# Altium project ELF 2 & ELF 2_Lite V1.3.PrjPcb (part 1 of 3)
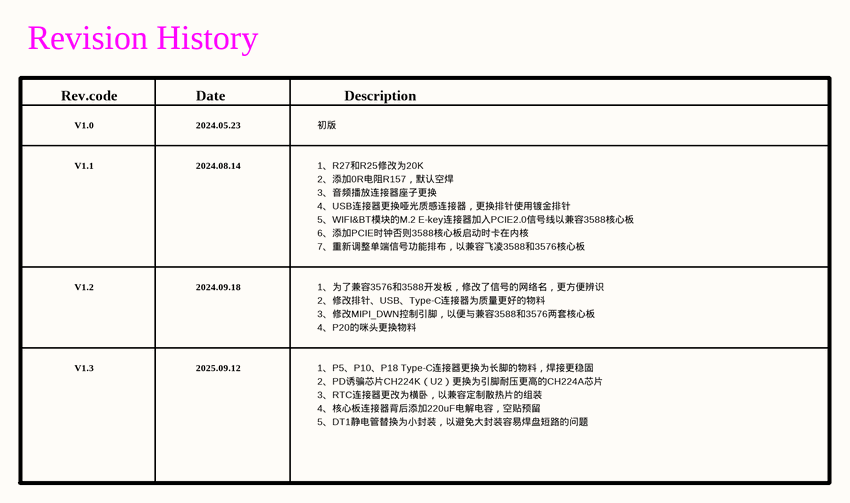
[diagram p0: 01 Revision History.SchDoc]
11 sheets, 469 parts. Net scope: global (net labels, ports and power ports of the same name join across sheets).
Board file: ELF 2 & ELF 2_Lite V1.3.PcbDoc
Sheets:
  01 Revision History.SchDoc
  02 Connector.SchDoc
  03 PWR.SchDoc
  04 Debug&TF card&RTC.SchDoc
  05 Ethernet.SchDoc
  06 MIPI.SchDoc
  07 HDMI.SchDoc
  08 TypeC USB DP.SchDoc
  09 Audio.SchDoc
  10 USB2.0 HUB&PCIe.SchDoc
  11 WIFI&BT&GPIO.SchDoc

## Sheet 01 Revision History.SchDoc
size A4; Revision: V1.2; SheetNumber: 1; SheetTotal: 11

### Notes on the sheet
- Revision History
- Rev.code
- Date
- Description
- V1.0
- V1.1
- 2024.05.23
- 2024.08.14
- 初版
- 1、R27和R25修改为20K
- 2、添加0R电阻R157，默认空焊
- 4、USB连接器更换哑光质感连接器，更换排针使用镀金排针
- 3、音频播放连接器座子更换
- 5、WIFI&BT模块的M.2 E-key连接器加入PCIE2.0信号线以兼容3588核心板
- 6、添加PCIE时钟否则3588核心板启动时卡在内核
- V1.2
- 2024.09.18
- 7、重新调整单端信号功能排布，以兼容飞凌3588和3576核心板
- 1、为了兼容3576和3588开发板，修改了信号的网络名，更方便辨识
- 2、修改排针、USB、Type-C连接器为质量更好的物料
- V1.3
- 2025.09.12
- 3、修改MIPI_DWN控制引脚，以便与兼容3588和3576两套核心板
- 4、P20的咪头更换物料
- 1、P5、P10、P18 Type-C连接器更换为长脚的物料，焊接更稳固
- 2、PD诱骗芯片CH224K（U2）更换为引脚耐压更高的CH224A芯片
- 5、DT1静电管替换为小封装，以避免大封装容易焊盘短路的问题
- 4、核心板连接器背后添加220uF电解电容，空贴预留
- 3、RTC连接器更改为横卧，以兼容定制散热片的组装
- 设计
- 审核
- 工艺
- 图纸名称
- 夏鑫宇
- 批准
- 标准化
- 日期
- 版本
- 页码
- 第
- 页
- 共

## Sheet 02 Connector.SchDoc
size A1; Revision: V1.2; SheetNumber: 2; SheetTotal: 11
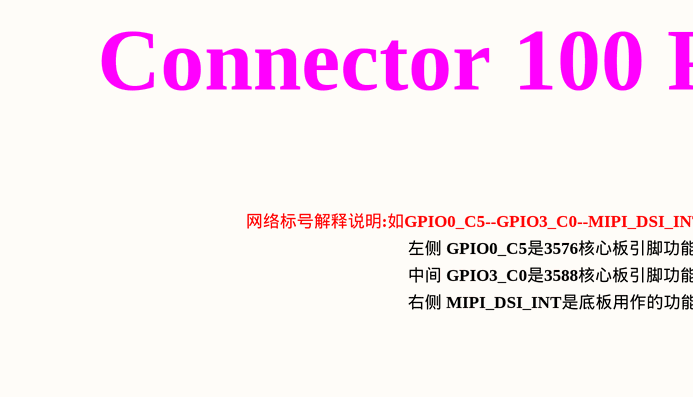
[diagram p1: 02 Connector.SchDoc, top left]
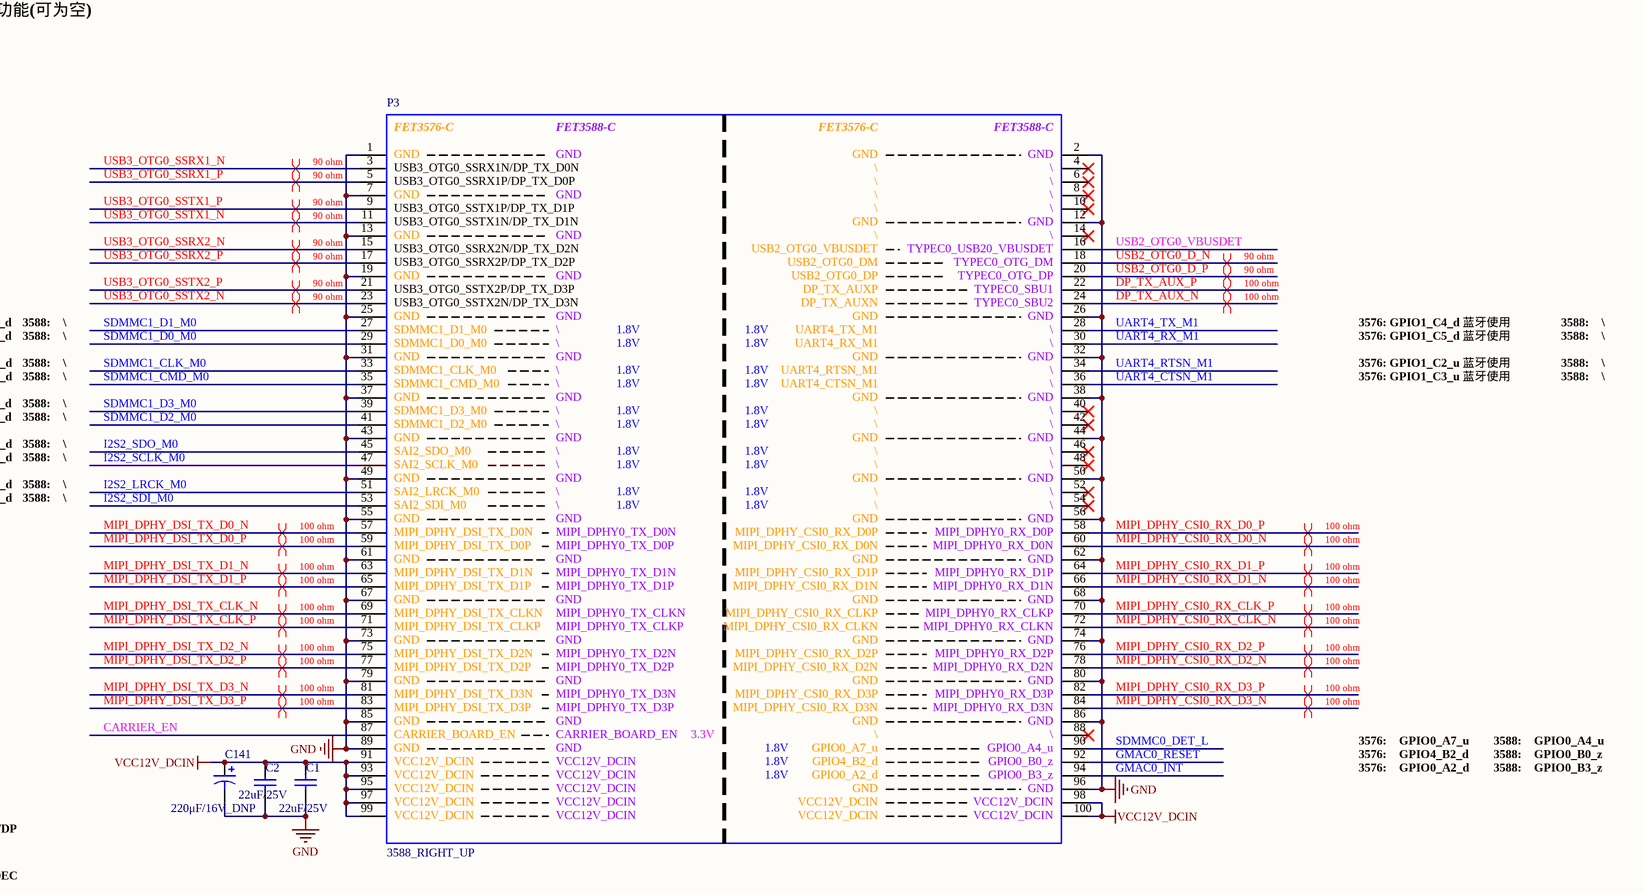
[diagram p2: 02 Connector.SchDoc, top right]
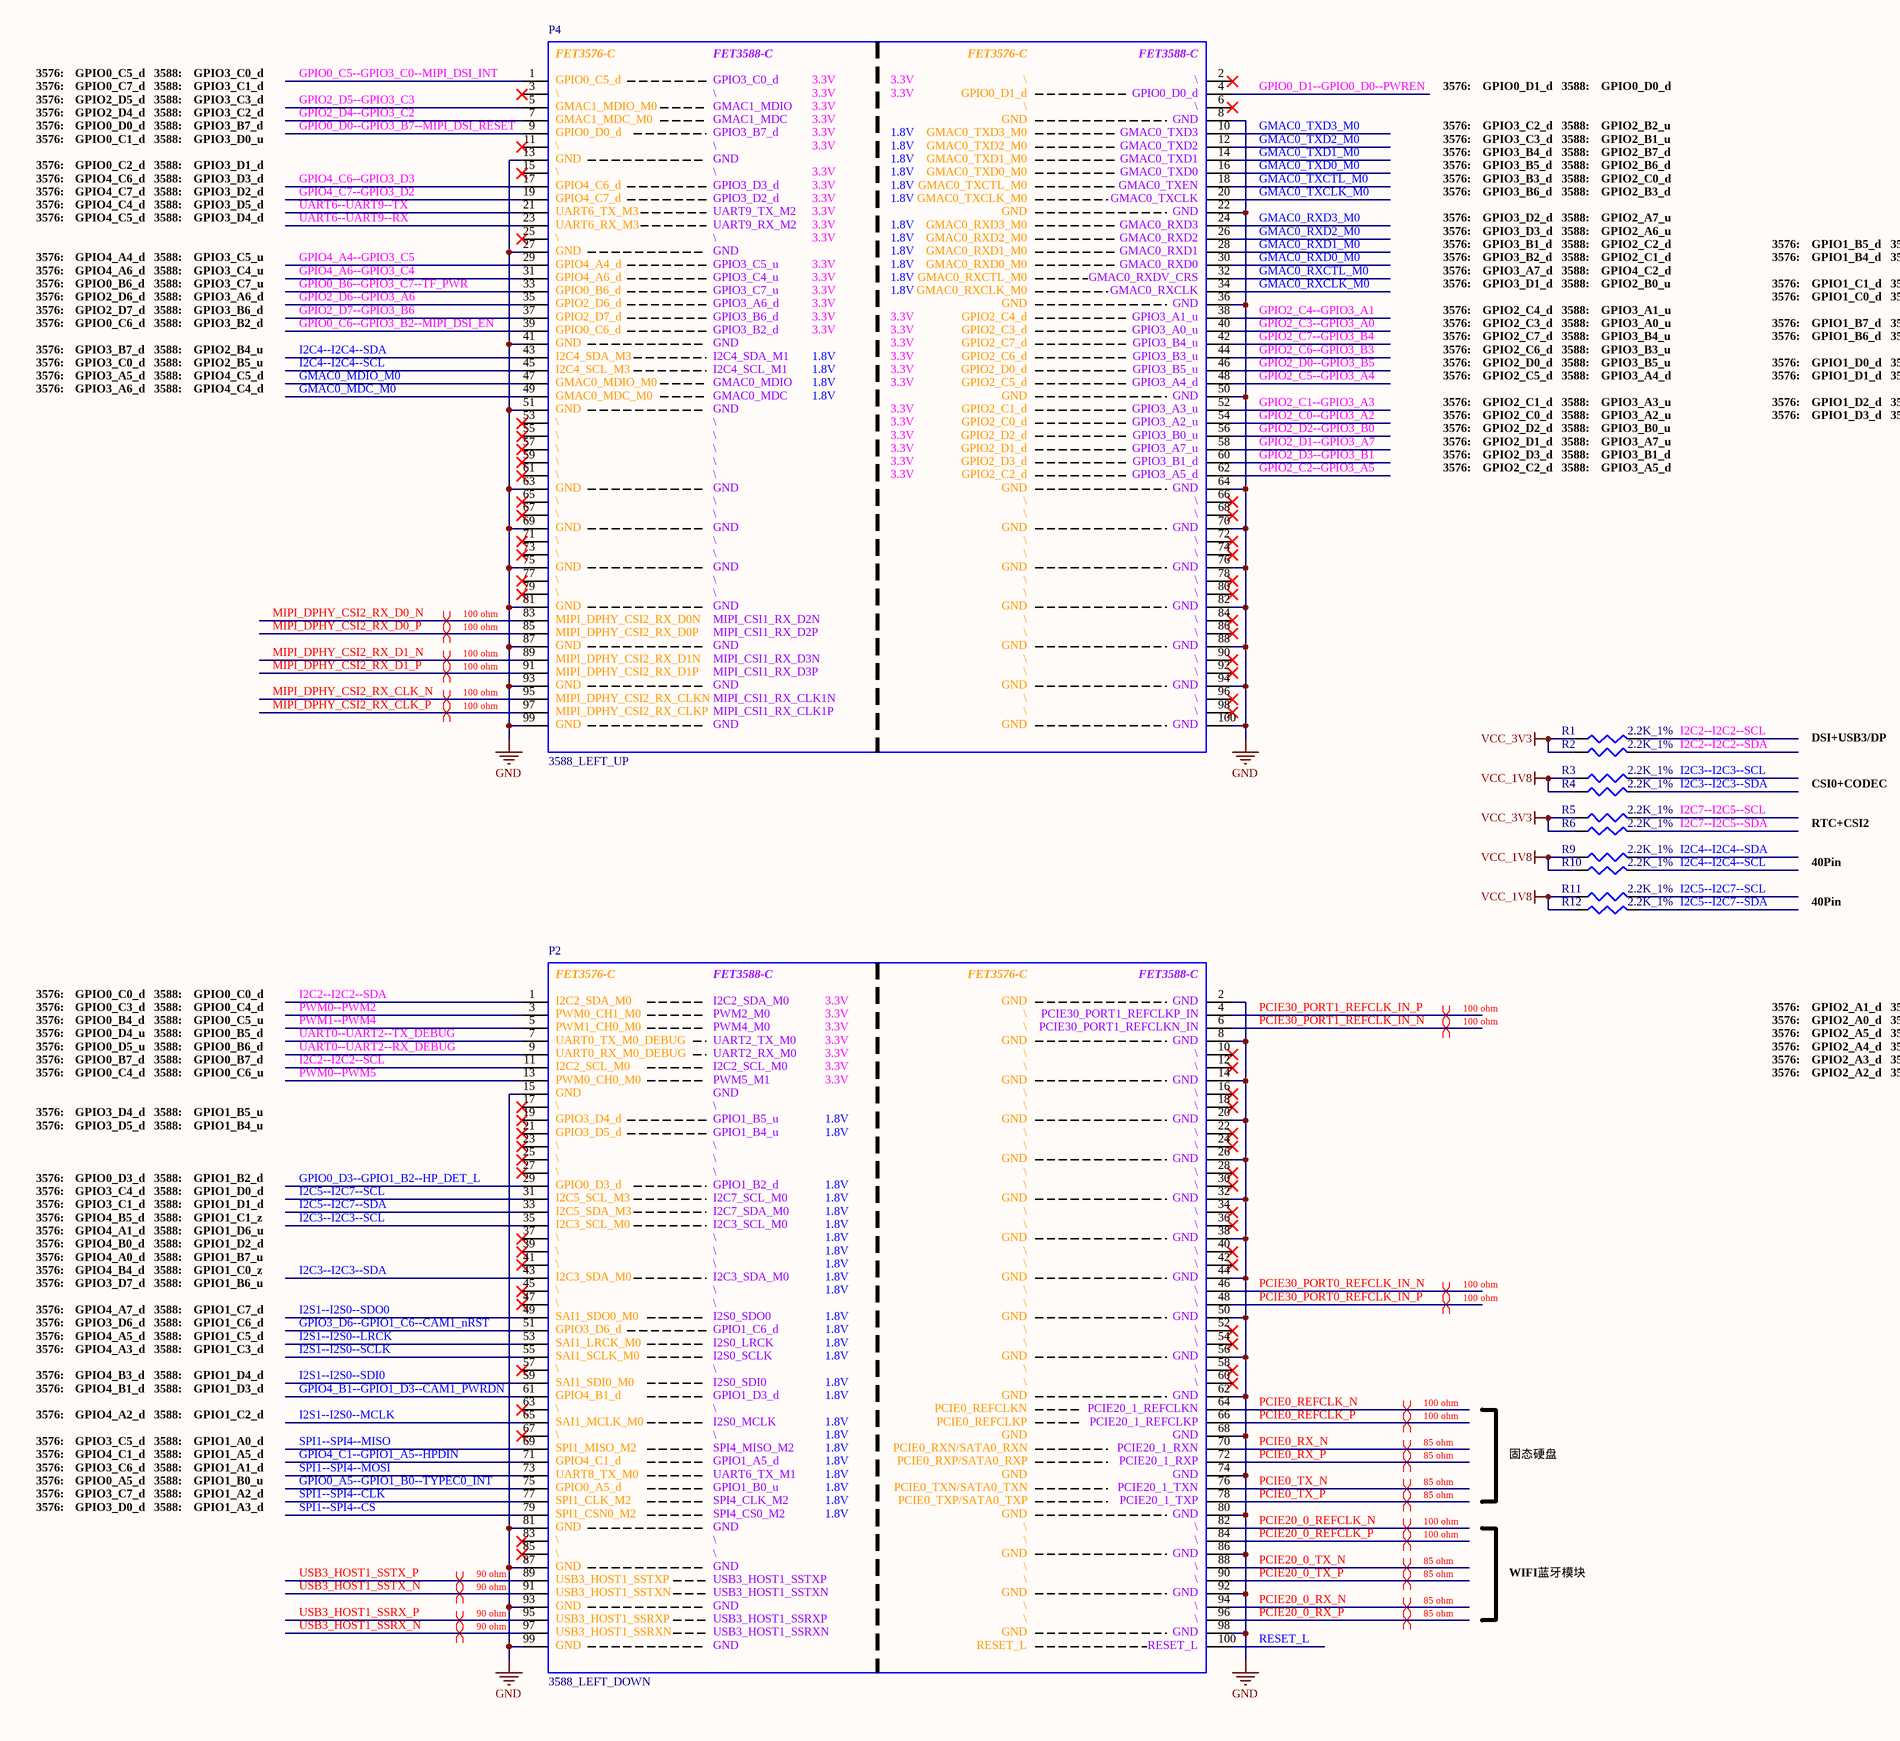
[diagram p3: 02 Connector.SchDoc, bottom left]
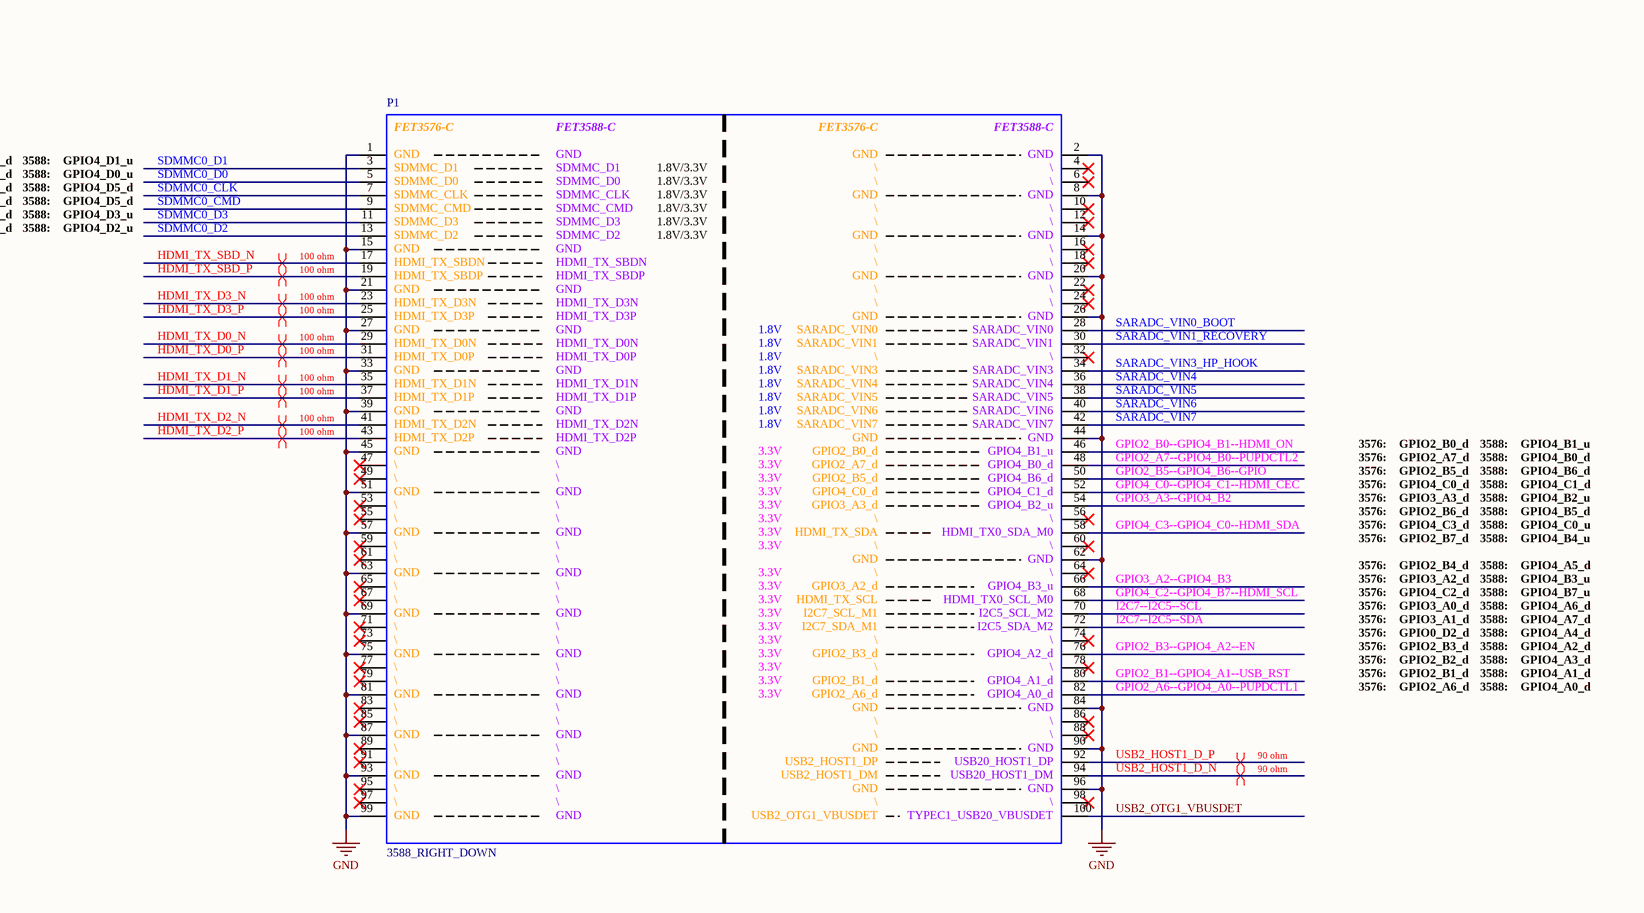
[diagram p4: 02 Connector.SchDoc, bottom right]

### Parts
C1  22uF/25V  [1206C]
C2  22uF/25V  [1206C]
C141  220μF/16V_DNP  [CAP SMT_6.3x7.7]
P1  3588_RIGHT_DOWN  [SOCKET_100PIN_0.4MM_F]
P2  3588_LEFT_DOWN  [SOCKET_100PIN_0.4MM_F]
P3  3588_RIGHT_UP  [SOCKET_100PIN_0.4MM_F]
P4  3588_LEFT_UP  [SOCKET_100PIN_0.4MM_F]
R1  2.2K_1%  [0402R]
R2  2.2K_1%  [0402R]
R3  2.2K_1%  [0402R]
R4  2.2K_1%  [0402R]
R5  2.2K_1%  [0402R]
R6  2.2K_1%  [0402R]
R9  2.2K_1%  [0402R]
R10  2.2K_1%  [0402R]
R11  2.2K_1%  [0402R]
R12  2.2K_1%  [0402R]

### Nets
GND: C1.1 C2.1 C141.2 P1.1(GND) P1.2(GND) P1.8(GND) P1.14(GND) P1.15(GND) P1.20(GND) P1.21(GND) P1.26(GND) P1.27(GND) P1.33(GND) P1.39(GND) P1.44(GND) P1.45(GND) P1.51(GND) P1.57(GND) P1.62(GND) P1.63(GND) P1.69(GND) P1.75(GND) P1.81(GND) P1.84(GND) P1.87(GND) P1.90(GND) P1.93(GND) P1.96(GND) P1.99(GND) P2.2(GND) P2.8(GND) P2.14(GND) P2.15(GND) P2.20(GND) P2.26(GND) P2.32(GND) P2.38(GND) P2.44(GND) P2.50(GND) P2.56(GND) P2.62(GND) P2.68(GND) P2.74(GND) P2.80(GND) P2.81(GND) P2.86(GND) P2.87(GND) P2.92(GND) P2.93(GND) P2.98(GND) P2.99(GND) P3.1(GND) P3.2(GND) P3.7(GND) P3.12(GND) P3.13(GND) P3.19(GND) P3.25(GND) P3.26(GND) P3.31(GND) P3.32(GND) P3.37(GND) P3.38(GND) P3.43(GND) P3.44(GND) P3.49(GND) P3.50(GND) P3.55(GND) P3.56(GND) P3.61(GND) P3.62(GND) P3.67(GND) P3.68(GND) P3.73(GND) P3.74(GND) P3.79(GND) P3.80(GND) P3.85(GND) P3.86(GND) P3.89(GND) P3.96(GND) P4.8(GND) P4.13(GND) P4.22(GND) P4.27(GND) P4.36(GND) P4.41(GND) P4.50(GND) P4.51(GND) P4.63(GND) P4.64(GND) P4.69(GND) P4.70(GND) P4.75(GND) P4.76(GND) P4.81(GND) P4.82(GND) P4.87(GND) P4.88(GND) P4.93(GND) P4.94(GND) P4.99(GND) P4.100(GND)
VCC12V_DCIN: C1.2 C2.2 C141.1 P3.91(VCC12V_DCIN) P3.93(VCC12V_DCIN) P3.95(VCC12V_DCIN) P3.97(VCC12V_DCIN) P3.98(VCC12V_DCIN) P3.99(VCC12V_DCIN) P3.100(VCC12V_DCIN)
VCC_1V8: R3.1 R4.1 R9.1 R10.1 R11.1 R12.1
VCC_3V3: R1.1 R2.1 R5.1 R6.1
CARRIER_EN: P3.87(CARRIER_BOARD_EN)
DP_TX_AUX_N: P3.24(DP_TX_AUXN)
DP_TX_AUX_P: P3.22(DP_TX_AUXP)
GMAC0_INT: P3.94(GPIO0_A2_d)
GMAC0_MDC_M0: P4.49(GMAC0_MDC_M0)
GMAC0_MDIO_M0: P4.47(GMAC0_MDIO_M0)
GMAC0_RESET: P3.92(GPIO4_B2_d)
GMAC0_RXCLK_M0: P4.34(GMAC0_RXCLK_M0)
GMAC0_RXCTL_M0: P4.32(GMAC0_RXCTL_M0)
GMAC0_RXD0_M0: P4.30(GMAC0_RXD0_M0)
GMAC0_RXD1_M0: P4.28(GMAC0_RXD1_M0)
GMAC0_RXD2_M0: P4.26(GMAC0_RXD2_M0)
GMAC0_RXD3_M0: P4.24(GMAC0_RXD3_M0)
GMAC0_TXCLK_M0: P4.20(GMAC0_TXCLK_M0)
GMAC0_TXCTL_M0: P4.18(GMAC0_TXCTL_M0)
GMAC0_TXD0_M0: P4.16(GMAC0_TXD0_M0)
GMAC0_TXD1_M0: P4.14(GMAC0_TXD1_M0)
GMAC0_TXD2_M0: P4.12(GMAC0_TXD2_M0)
GMAC0_TXD3_M0: P4.10(GMAC0_TXD3_M0)
GPIO0_A5--GPIO1_B0--TYPEC0_INT: P2.75(GPIO0_A5_d)
GPIO0_B6--GPIO3_C7--TF_PWR: P4.33(GPIO0_B6_d)
GPIO0_C5--GPIO3_C0--MIPI_DSI_INT: P4.1(GPIO0_C5_d)
GPIO0_C6--GPIO3_B2--MIPI_DSI_EN: P4.39(GPIO0_C6_d)
GPIO0_D0--GPIO3_B7--MIPI_DSI_RESET: P4.9(GPIO0_D0_d)
GPIO0_D1--GPIO0_D0--PWREN: P4.4(GPIO0_D1_d)
GPIO0_D3--GPIO1_B2--HP_DET_L: P2.29(GPIO0_D3_d_1V8)
GPIO2_A6--GPIO4_A0--PUPDCTL1: P1.82(TYPEC_DPTX_AUX_PUPDCTL1)
GPIO2_A7--GPIO4_B0--PUPDCTL2: P1.48(TYPEC_DPTX_AUX_PUPDCTL2)
GPIO2_B0--GPIO4_B1--HDMI_ON: P1.46(HDMI_TX_ON_H)
GPIO2_B1--GPIO4_A1--USB_RST: P1.80(GPIO2_B1_d)
GPIO2_B3--GPIO4_A2--EN: P1.76(GPIO2_B3_d)
GPIO2_B5--GPIO4_B6--GPIO: P1.50(GPIO2_B5_d)
GPIO2_C0--GPIO3_A2: P4.54(GMAC1_RXD2_M0)
GPIO2_C1--GPIO3_A3: P4.52(GMAC1_RXD3_M0)
GPIO2_C2--GPIO3_A5: P4.62(GMAC1_RXCLK_M0)
GPIO2_C3--GPIO3_A0: P4.40(GMAC1_TXD2_M0)
GPIO2_C4--GPIO3_A1: P4.38(GMAC1_TXD3_M0)
GPIO2_C5--GPIO3_A4: P4.48(GMAC1_TXCLK_M0)
GPIO2_C6--GPIO3_B3: P4.44(GMAC1_TXD0_M0)
GPIO2_C7--GPIO3_B4: P4.42(GMAC1_TXD1_M0)
GPIO2_D0--GPIO3_B5: P4.46(GMAC1_TXCTL_M0)
GPIO2_D1--GPIO3_A7: P4.58(GMAC1_RXD0_M0)
GPIO2_D2--GPIO3_B0: P4.56(GMAC1_RXD1_M0)
GPIO2_D3--GPIO3_B1: P4.60(GMAC1_RXCTL_M0)
GPIO2_D4--GPIO3_C2: P4.7(GMAC1_MDC_M0)
GPIO2_D5--GPIO3_C3: P4.5(GMAC1_MDIO_M0)
GPIO2_D6--GPIO3_A6: P4.35(ETH_CLK1_25M_OUT_M0)
GPIO2_D7--GPIO3_B6: P4.37(ETH1_MCLK_M0)
GPIO3_A2--GPIO4_B3: P1.66(CAN1_TX_M3)
GPIO3_A3--GPIO4_B2: P1.54(CAN1_RX_M3)
GPIO3_D6--GPIO1_C6--CAM1_nRST: P2.51(GPIO3_D6_d)
GPIO4_A4--GPIO3_C5: P4.29(CAN0_TX_M2_3V3)
GPIO4_A6--GPIO3_C4: P4.31(CAN0_RX_M2_3V3)
GPIO4_B1--GPIO1_D3--CAM1_PWRDN: P2.61(UART5_RX_M1)
GPIO4_C0--GPIO4_C1--HDMI_CEC: P1.52(HDMI_TX_CEC_M0)
GPIO4_C1--GPIO1_A5--HPDIN: P2.71(HDMI_TX_HPDIN_M0_1V8)
GPIO4_C2--GPIO4_B7--HDMI_SCL: P1.68(HDMI_TX_SCL)
GPIO4_C3--GPIO4_C0--HDMI_SDA: P1.58(HDMI_TX_SDA)
GPIO4_C6--GPIO3_D3: P4.17(GPIO4_C6_d)
GPIO4_C7--GPIO3_D2: P4.19(GPIO4_C7_d)
HDMI_TX_D0_N: P1.29(HDMI_TX_D0N)
HDMI_TX_D0_P: P1.31(HDMI_TX_D0P)
HDMI_TX_D1_N: P1.35(HDMI_TX_D1N)
HDMI_TX_D1_P: P1.37(HDMI_TX_D1P)
HDMI_TX_D2_N: P1.41(HDMI_TX_D2N)
HDMI_TX_D2_P: P1.43(HDMI_TX_D2P)
HDMI_TX_D3_N: P1.23(HDMI_TX_D3N)
HDMI_TX_D3_P: P1.25(HDMI_TX_D3P)
HDMI_TX_SBD_N: P1.17(HDMI_TX_SBDN)
HDMI_TX_SBD_P: P1.19(HDMI_TX_SBDP)
I2C2--I2C2--SCL: P2.11(I2C2_SCL_M0) R1.2
I2C2--I2C2--SDA: P2.1(I2C2_SDA_M0) R2.2
I2C3--I2C3--SCL: P2.35(I2C3_SCL_M0) R3.2
I2C3--I2C3--SDA: P2.43(I2C3_SDA_M0) R4.2
I2C4--I2C4--SCL: P4.45(I2C4_SCL_M3) R10.2
I2C4--I2C4--SDA: P4.43(I2C4_SDA_M3) R9.2
I2C5--I2C7--SCL: P2.31(I2C5_SCL_M3) R11.2
I2C5--I2C7--SDA: P2.33(I2C5_SDA_M3) R12.2
I2C7--I2C5--SCL: P1.70(I2C7_SCL_M1) R5.2
I2C7--I2C5--SDA: P1.72(I2C7_SDA_M1) R6.2
I2S1--I2S0--LRCK: P2.53(SAI1_LRCK_M0)
I2S1--I2S0--MCLK: P2.65(SAI1_MCLK_M0)
I2S1--I2S0--SCLK: P2.55(SAI1_SCLK_M0)
I2S1--I2S0--SDI0: P2.59(SAI1_SDI0_M0)
I2S1--I2S0--SDO0: P2.49(SAI1_SDO0_M0)
I2S2_LRCK_M0: P3.51(SAI2_LRCK_M0)
I2S2_SCLK_M0: P3.47(SAI2_SCLK_M0)
I2S2_SDI_M0: P3.53(SAI2_SDI_M0)
I2S2_SDO_M0: P3.45(SAI2_SDO_M0)
MIPI_DPHY_CSI0_RX_CLK_N: P3.72(MIPI_DPHY_CSI0_RX_CLKN)
MIPI_DPHY_CSI0_RX_CLK_P: P3.70(MIPI_DPHY_CSI0_RX_CLKP)
MIPI_DPHY_CSI0_RX_D0_N: P3.60(MIPI_DPHY_CSI0_RX_D0N)
MIPI_DPHY_CSI0_RX_D0_P: P3.58(MIPI_DPHY_CSI0_RX_D0P)
MIPI_DPHY_CSI0_RX_D1_N: P3.66(MIPI_DPHY_CSI0_RX_D1N)
MIPI_DPHY_CSI0_RX_D1_P: P3.64(MIPI_DPHY_CSI0_RX_D1P)
MIPI_DPHY_CSI0_RX_D2_N: P3.78(MIPI_DPHY_CSI0_RX_D2N)
MIPI_DPHY_CSI0_RX_D2_P: P3.76(MIPI_DPHY_CSI0_RX_D2P)
MIPI_DPHY_CSI0_RX_D3_N: P3.84(MIPI_DPHY_CSI0_RX_D3N)
MIPI_DPHY_CSI0_RX_D3_P: P3.82(MIPI_DPHY_CSI0_RX_D3P)
MIPI_DPHY_CSI2_RX_CLK_N: P4.95(MIPI_DPHY_CSI2_RX_CLKN)
MIPI_DPHY_CSI2_RX_CLK_P: P4.97(MIPI_DPHY_CSI2_RX_CLKP)
MIPI_DPHY_CSI2_RX_D0_N: P4.83(MIPI_DPHY_CSI2_RX_D0N)
MIPI_DPHY_CSI2_RX_D0_P: P4.85(MIPI_DPHY_CSI2_RX_D0P)
MIPI_DPHY_CSI2_RX_D1_N: P4.89(MIPI_DPHY_CSI2_RX_D1N)
MIPI_DPHY_CSI2_RX_D1_P: P4.91(MIPI_DPHY_CSI2_RX_D1P)
MIPI_DPHY_DSI_TX_CLK_N: P3.69(MIPI_DPHY_DSI_TX_CLKN)
MIPI_DPHY_DSI_TX_CLK_P: P3.71(MIPI_DPHY_DSI_TX_CLKP)
MIPI_DPHY_DSI_TX_D0_N: P3.57(MIPI_DPHY_DSI_TX_D0N)
MIPI_DPHY_DSI_TX_D0_P: P3.59(MIPI_DPHY_DSI_TX_D0P)
MIPI_DPHY_DSI_TX_D1_N: P3.63(MIPI_DPHY_DSI_TX_D1N)
MIPI_DPHY_DSI_TX_D1_P: P3.65(MIPI_DPHY_DSI_TX_D1P)
MIPI_DPHY_DSI_TX_D2_N: P3.75(MIPI_DPHY_DSI_TX_D2N)
MIPI_DPHY_DSI_TX_D2_P: P3.77(MIPI_DPHY_DSI_TX_D2P)
MIPI_DPHY_DSI_TX_D3_N: P3.81(MIPI_DPHY_DSI_TX_D3N)
MIPI_DPHY_DSI_TX_D3_P: P3.83(MIPI_DPHY_DSI_TX_D3P)
PCIE0_REFCLK_N: P2.64(PCIE0_REFCLKN)
PCIE0_REFCLK_P: P2.66(PCIE0_REFCLKP)
PCIE0_RX_N: P2.70(PCIE0_RXN/SATA0_RXN)
PCIE0_RX_P: P2.72(PCIE0_RXP/SATA0_RXP)
PCIE0_TX_N: P2.76(PCIE0_TXN/SATA0_TXN)
PCIE0_TX_P: P2.78(PCIE0_TXP/SATA0_TXP)
PCIE20_0_REFCLK_N: P2.82
PCIE20_0_REFCLK_P: P2.84
PCIE20_0_RX_N: P2.94
PCIE20_0_RX_P: P2.96
PCIE20_0_TX_N: P2.88
PCIE20_0_TX_P: P2.90
PCIE30_PORT0_REFCLK_IN_N: P2.46
PCIE30_PORT0_REFCLK_IN_P: P2.48
PCIE30_PORT1_REFCLK_IN_N: P2.6
PCIE30_PORT1_REFCLK_IN_P: P2.4
PWM0--PWM2: P2.3(PWM0_CH1_M0)
PWM0--PWM5: P2.13(PWM0_CH0_M0)
PWM1--PWM4: P2.5(PWM1_CH0_M0)
RESET_L: P2.100(RESET_L)
SARADC_VIN0_BOOT: P1.28(SARADC_VIN0_BOOT)
SARADC_VIN1_RECOVERY: P1.30(SARADC_VIN1_KEY/RECOVERY)
SARADC_VIN3_HP_HOOK: P1.34(SARADC_VIN3_HP_HOOK)
SARADC_VIN4: P1.36(SARADC_VIN4)
SARADC_VIN5: P1.38(SARADC_VIN5)
SARADC_VIN6: P1.40(SARADC_VIN6)
SARADC_VIN7: P1.42(SARADC_VIN7_LCD_ID)
SDMMC0_CLK: P1.7(SDMMC0_CLK)
SDMMC0_CMD: P1.9(SDMMC0_CMD)
SDMMC0_D0: P1.5(SDMMC0_D0)
SDMMC0_D1: P1.3(SDMMC0_D1)
SDMMC0_D2: P1.13(SDMMC0_D2)
SDMMC0_D3: P1.11(SDMMC0_D3)
SDMMC0_DET_L: P3.90(SDMMC0_DET_L)
SDMMC1_CLK_M0: P3.33(SDMMC1_CLK_M0)
SDMMC1_CMD_M0: P3.35(SDMMC1_CMD_M0)
SDMMC1_D0_M0: P3.29(SDMMC1_D0_M0)
SDMMC1_D1_M0: P3.27(SDMMC1_D1_M0)
SDMMC1_D2_M0: P3.41(SDMMC1_D2_M0)
SDMMC1_D3_M0: P3.39(SDMMC1_D3_M0)
SPI1--SPI4--CLK: P2.77(UART8_RTSN_M0)
SPI1--SPI4--CS: P2.79(UART8_CTSN_M0)
SPI1--SPI4--MISO: P2.69(UART8_RX_M0)
SPI1--SPI4--MOSI: P2.73(UART8_TX_M0)
UART0--UART2--RX_DEBUG: P2.9(UART0_RX_M0_DEBUG)
UART0--UART2--TX_DEBUG: P2.7(UART0_TX_M0_DEBUG)
UART4_CTSN_M1: P3.36(UART4_CTSN_M1)
UART4_RTSN_M1: P3.34(UART4_RTSN_M1)
UART4_RX_M1: P3.30(UART4_RX_M1)
UART4_TX_M1: P3.28(UART4_TX_M1)
UART6--UART9--RX: P4.23(UART6_RX_M3)
UART6--UART9--TX: P4.21(UART6_TX_M3)
USB2_HOST1_D_N: P1.94(USB2_HOST1_DM)
USB2_HOST1_D_P: P1.92(USB2_HOST1_DP)
USB2_OTG0_D_N: P3.18(USB2_OTG0_DM)
USB2_OTG0_D_P: P3.20(USB2_OTG0_DP)
USB2_OTG0_VBUSDET: P3.16(USB2_OTG0_VBUSDET)
USB2_OTG1_VBUSDET: P1.100(USB2_OTG1_VBUSDET)
USB3_HOST1_SSRX_N: P2.97(PCIE1_RXN/USB3_HOST1_SSRXN)
USB3_HOST1_SSRX_P: P2.95(PCIE1_RXP/USB3_HOST1_SSRXP)
USB3_HOST1_SSTX_N: P2.91(PCIE1_TXN/USB3_HOST1_SSTXN)
USB3_HOST1_SSTX_P: P2.89(PCIE1_TXP/USB3_HOST1_SSTXP)
USB3_OTG0_SSRX1_N: P3.3(USB3_OTG0_SSRX1N/DP_TX_D0N)
USB3_OTG0_SSRX1_P: P3.5(USB3_OTG0_SSRX1P/DP_TX_D0P)
USB3_OTG0_SSRX2_N: P3.15(USB3_OTG0_SSRX2N/DP_TX_D2N)
USB3_OTG0_SSRX2_P: P3.17(USB3_OTG0_SSRX2P/DP_TX_D2P)
USB3_OTG0_SSTX1_N: P3.11(USB3_OTG0_SSTX1N/DP_TX_D1N)
USB3_OTG0_SSTX1_P: P3.9(USB3_OTG0_SSTX1P/DP_TX_D1P)
USB3_OTG0_SSTX2_N: P3.23(USB3_OTG0_SSTX2N/DP_TX_D3N)
USB3_OTG0_SSTX2_P: P3.21(USB3_OTG0_SSTX2P/DP_TX_D3P)

Not connected (* = marked no-connect by the designer): P1 4* 6* 10* 12* 16* 18* 22* 24* 32(SARADC_VIN2_HW_ID)* 47* 49* 53* 55* 56(I2C8_SCL_M2)* 59* 60(I2C8_SDA_M2)* 61* 64(PCIE0_PERSTn)* 65* 67* 71* 73* 74(PCIE0_WAKEn_M0)* 77* 78(PCIE0_CLKREQn_M0)* 79* 83* 85* 86* 88* 89* 91* 95* 97* 98(USB2_OTG1_ID)*; P2 10* 12* 16* 17* 18* 19(GPIO3_D4_d)* 21(GPIO3_D5_d)* 22* 23* 24* 25* 27* 28* 30* 34* 36* 37(CAM_CLK2_OUT_M0)* 39(UART5_TX_M1)* 40* 41(CAM_CLK1_OUT_M0)* 42* 45(CAM_CLK0_OUT_M0)* 47* 52* 54* 57* 58* 60* 63(GND)* 67(GPIO0_A0_d)* 83(PCIE1_REFCLKP)* 85(PCIE1_REFCLKN)*; P3 4* 6* 8* 10* 14(USB2_OTG0_ID)* 40(WIFI_REG_ON_H)* 42(BT_REG_ON_H)* 46(HOST_WAKE_BT_H)* 48(GPIO1_D5_d)* 52(WIFI_WAKE_HOST_H)* 54(BT_WAKE_HOST_H)* 88(PWRON_L)*; P4 2(PWM1_CH1_M0)* 3(GPIO0_C7_d)* 6* 11(I2C0_SCL_M1)* 15(I2C0_SDA_M1)* 25(WIFI_PEN)* 53* 55* 57(ETH_CLK0_25M_OUT_M0)* 59* 61(ETH0_MCLK_M0)* 65(MIPI_DPHY_CSI1_RX_D0N)* 66(MIPI_DPHY_CSI3_RX_D0P)* 67(MIPI_DPHY_CSI1_RX_D0P)* 68(MIPI_DPHY_CSI3_RX_D0N)* 71(MIPI_DPHY_CSI1_RX_D1N)* 72(MIPI_DPHY_CSI3_RX_D1P)* 73(MIPI_DPHY_CSI1_RX_D1P)* 74(MIPI_DPHY_CSI3_RX_D1N)* 77(MIPI_DPHY_CSI1_RX_CLKN)* 78(MIPI_DPHY_CSI3_RX_CLKP)* 79(MIPI_DPHY_CSI1_RX_CLKP)* 80(MIPI_DPHY_CSI3_RX_CLKN)* 84(MIPI_DPHY_CSI4_RX_D0P)* 86(MIPI_DPHY_CSI4_RX_D0N)* 90(MIPI_DPHY_CSI4_RX_D1P)* 92(MIPI_DPHY_CSI4_RX_D1N)* 96(MIPI_DPHY_CSI4_RX_CLKP)* 98(MIPI_DPHY_CSI4_RX_CLKN)*

### Layout directives
differential pair; differential pair class 100 ohm: DP_TX_AUX_N, DP_TX_AUX_P, HDMI_TX_D0_N, HDMI_TX_D0_P, HDMI_TX_D1_N, HDMI_TX_D1_P, HDMI_TX_D2_N, HDMI_TX_D2_P, HDMI_TX_D3_N, HDMI_TX_D3_P, HDMI_TX_SBD_N, HDMI_TX_SBD_P, MIPI_DPHY_CSI0_RX_CLK_N, MIPI_DPHY_CSI0_RX_CLK_P, MIPI_DPHY_CSI0_RX_D0_N, MIPI_DPHY_CSI0_RX_D0_P, MIPI_DPHY_CSI0_RX_D1_N, MIPI_DPHY_CSI0_RX_D1_P, MIPI_DPHY_CSI0_RX_D2_N, MIPI_DPHY_CSI0_RX_D2_P, MIPI_DPHY_CSI0_RX_D3_N, MIPI_DPHY_CSI0_RX_D3_P, MIPI_DPHY_CSI2_RX_CLK_N, MIPI_DPHY_CSI2_RX_CLK_P, MIPI_DPHY_CSI2_RX_D0_N, MIPI_DPHY_CSI2_RX_D0_P, MIPI_DPHY_CSI2_RX_D1_N, MIPI_DPHY_CSI2_RX_D1_P, MIPI_DPHY_DSI_TX_CLK_N, MIPI_DPHY_DSI_TX_CLK_P, MIPI_DPHY_DSI_TX_D0_N, MIPI_DPHY_DSI_TX_D0_P, MIPI_DPHY_DSI_TX_D1_N, MIPI_DPHY_DSI_TX_D1_P, MIPI_DPHY_DSI_TX_D2_N, MIPI_DPHY_DSI_TX_D2_P, MIPI_DPHY_DSI_TX_D3_N, MIPI_DPHY_DSI_TX_D3_P, PCIE0_REFCLK_N, PCIE0_REFCLK_P, PCIE20_0_REFCLK_N, PCIE20_0_REFCLK_P, PCIE30_PORT0_REFCLK_IN_N, PCIE30_PORT0_REFCLK_IN_P, PCIE30_PORT1_REFCLK_IN_N, PCIE30_PORT1_REFCLK_IN_P
differential pair; differential pair class 90 ohm: USB2_HOST1_D_N, USB2_HOST1_D_P, USB2_OTG0_D_N, USB2_OTG0_D_P, USB3_HOST1_SSRX_N, USB3_HOST1_SSRX_P, USB3_HOST1_SSTX_N, USB3_HOST1_SSTX_P, USB3_OTG0_SSRX1_N, USB3_OTG0_SSRX1_P, USB3_OTG0_SSRX2_N, USB3_OTG0_SSRX2_P, USB3_OTG0_SSTX1_N, USB3_OTG0_SSTX1_P, USB3_OTG0_SSTX2_N, USB3_OTG0_SSTX2_P
differential pair; differential pair class 85 ohm: PCIE0_RX_N, PCIE0_RX_P, PCIE0_TX_N, PCIE0_TX_P, PCIE20_0_RX_N, PCIE20_0_RX_P, PCIE20_0_TX_N, PCIE20_0_TX_P

### Notes on the sheet
- Connector 100 Pin * 4
- 网络标号解释说明:如GPIO0_C5--GPIO3_C0--MIPI_DSI_INT
- 左侧 GPIO0_C5是3576核心板引脚功能
- 中间 GPIO3_C0是3588核心板引脚功能
- 右侧 MIPI_DSI_INT是底板用作的功能(可为空)
- 3576:
- GPIO0_C5_d
- GPIO2_D5_d
- GPIO2_D4_d
- GPIO0_D0_d
- GPIO0_C7_d
- 3588:
- GPIO3_C0_d
- GPIO3_C3_d
- GPIO3_C2_d
- GPIO3_B7_d
- GPIO3_C1_d
- GPIO0_D1_d
- GPIO2_B2_u
- GPIO0_C1_d
- GPIO0_C2_d
- GPIO4_C6_d
- GPIO4_C7_d
- GPIO3_D0_u
- GPIO3_D1_d
- GPIO3_D3_d
- GPIO3_D2_d
- GPIO3_B4_d
- GPIO3_B5_d
- GPIO3_B3_d
- GPIO3_B6_d
- GPIO2_B1_u
- GPIO2_B7_d
- GPIO2_B6_d
- GPIO2_C0_d
- GPIO2_B3_d
- GPIO4_C4_d
- GPIO4_C5_d
- GPIO4_A4_d
- GPIO3_D5_d
- GPIO3_D4_d
- GPIO3_C5_u
- GPIO3_B1_d
- GPIO3_B2_d
- GPIO2_A7_u
- GPIO2_A6_u
- GPIO2_C2_d
- GPIO2_C1_d
- GPIO1_B5_d
- GPIO1_B4_d
- \
- 3576: GPIO1_C4_d 蓝牙使用
- 3576: GPIO1_C5_d 蓝牙使用
- GPIO4_A6_d
- GPIO0_B6_d
- GPIO2_D6_d
- GPIO2_D7_d
- GPIO0_C6_d
- GPIO3_C4_u
- GPIO3_C7_u
- GPIO3_A6_d
- GPIO2_C4_d
- GPIO2_C3_d
- GPIO3_A7_d
- GPIO3_A1_u
- GPIO3_A0_u
- GPIO4_C2_d
- GPIO2_B0_u
- GPIO1_C1_d
- GPIO1_C0_d
- GPIO1_B7_d
- 3576: GPIO1_C3_u 蓝牙使用
- 3576: GPIO1_C2_u 蓝牙使用
- GPIO3_A5_d
- GPIO2_B4_u
- GPIO2_B5_u
- GPIO2_C7_d
- GPIO2_C6_d
- GPIO2_D0_d
- GPIO2_C5_d
- GPIO3_B4_u
- GPIO3_B3_u
- GPIO3_B5_u
- GPIO3_A4_d
- GPIO1_B6_d
- GPIO1_D0_d
- GPIO1_D1_d
- GPIO2_D2_d
- GPIO2_D1_d
- GPIO2_D3_d
- GPIO3_A3_u
- GPIO3_A2_u
- GPIO3_B0_u
- GPIO3_A7_u
- GPIO1_D2_d
- GPIO1_D3_d
- GPIO0_A7_u
- GPIO0_A4_u
- GPIO4_B2_d
- GPIO0_A2_d
- GPIO0_B0_z
- GPIO0_B3_z
- CSI0+CODEC
- DSI+USB3/DP
- RTC+CSI2
- 40Pin
- GPIO0_C0_d
- GPIO0_C3_d
- GPIO0_B4_d
- GPIO0_D4_u
- GPIO0_D5_u
- GPIO0_C4_d
- GPIO0_C5_u
- GPIO0_B5_d
- GPIO2_A1_d
- GPIO2_A0_d
- GPIO2_A5_d
- GPIO2_A4_d
- GPIO4_D1_u
- GPIO4_D0_u
- GPIO4_D5_d
- GPIO0_B7_d
- GPIO0_C6_u
- GPIO1_B5_u
- GPIO2_A3_d
- GPIO2_A2_d
- GPIO4_D3_u
- GPIO4_D2_u
- GPIO0_D3_d
- GPIO1_B2_d
- GPIO1_B4_u
- GPIO3_C4_d
- GPIO4_B5_d
- GPIO4_B0_d
- GPIO4_A1_d
- GPIO1_C1_z
- GPIO1_D6_u
- GPIO4_B4_d
- GPIO4_A7_d
- GPIO4_A0_d
- GPIO3_D7_d
- GPIO1_C0_z
- GPIO1_C7_d
- GPIO1_B7_u
- GPIO1_B6_u
- GPIO2_B0_d
- GPIO2_A7_d
- GPIO2_B5_d
- GPIO4_B1_u
- GPIO4_B6_d
- GPIO3_D6_d
- GPIO4_A5_d
- GPIO4_A3_d
- GPIO4_B3_d
- GPIO1_C6_d
- GPIO1_C5_d
- GPIO1_C3_d
- GPIO1_D4_d
- GPIO4_C0_d
- GPIO3_A3_d
- GPIO4_C3_d
- GPIO4_C1_d
- GPIO4_B2_u
- GPIO4_C0_u
- GPIO4_B4_u
- GPIO4_B1_d
- GPIO3_C5_d
- GPIO4_A2_d
- GPIO1_A0_d
- GPIO1_C2_d
- GPIO2_B4_d
- GPIO3_A2_d
- GPIO3_A0_d
- GPIO4_B3_u
- GPIO4_B7_u
- GPIO3_C6_d
- GPIO0_A5_d
- GPIO3_C7_d
- GPIO3_D0_d
- GPIO1_A5_d
- GPIO1_A1_d
- GPIO1_B0_u
- GPIO1_A2_d
- GPIO1_A3_d
- 固态硬盘
- GPIO3_A1_d
- GPIO0_D2_d
- GPIO2_B2_d
- GPIO2_B1_d
- WIFI蓝牙模块
- GPIO2_A6_d
- 图纸名称
- 设计
- 审核
- 工艺
- 版本
- 夏鑫宇
- 批准
- 标准化
- 日期
- 页码
- 第
- 页
- 共
- (in symbol 3588_LEFT_DOWN) FET3576-C; FET3588-C; 3.3V; PWM2_M0; \; PCIE30_PORT1_REFCLKP_IN; PWM4_M0; PCIE30_PORT1_REFCLKN_IN; UART2_TX_M0; UART2_RX_M0; PWM5_M1; GPIO1_B5_u; 1.8V; GPIO1_B4_u; GPIO0_D3_d; GPIO1_B2_d; I2C7_SCL_M0; I2C7_SDA_M0; I2S0_SDO0; GPIO1_C6_d; I2S0_LRCK; I2S0_SCLK; I2S0_SDI0; GPIO4_B1_d; GPIO1_D3_d; PCIE20_1_REFCLKN; I2S0_MCLK; PCIE20_1_REFCLKP; SPI1_MISO_M2; SPI4_MISO_M2; PCIE20_1_RXN; GPIO4_C1_d; GPIO1_A5_d; PCIE20_1_RXP; UART6_TX_M1; GPIO1_B0_u; PCIE20_1_TXN; SPI1_CLK_M2; SPI4_CLK_M2; PCIE20_1_TXP; SPI1_CSN0_M2; SPI4_CS0_M2; USB3_HOST1_SSTXP; USB3_HOST1_SSTXN; USB3_HOST1_SSRXP; USB3_HOST1_SSRXN
- (in symbol 3588_LEFT_UP) FET3576-C; FET3588-C; GPIO3_C0_d; 3.3V; \; GMAC1_MDIO; GMAC1_MDC; GPIO3_B7_d; 1.8V; GMAC0_TXD3; GMAC0_TXD2; GMAC0_TXD1; GMAC0_TXD0; GPIO3_D3_d; GMAC0_TXEN; GPIO3_D2_d; GMAC0_TXCLK; UART9_TX_M2; UART9_RX_M2; GMAC0_RXD3; GMAC0_RXD2; GMAC0_RXD1; GPIO4_A4_d; GPIO3_C5_u; GMAC0_RXD0; GPIO4_A6_d; GPIO3_C4_u; GMAC0_RXDV_CRS; GPIO3_C7_u; GMAC0_RXCLK; GPIO2_D6_d; GPIO3_A6_d; GPIO2_D7_d; GPIO3_B6_d; GPIO2_C4_d; GPIO3_A1_u; GPIO3_B2_d; GPIO2_C3_d; GPIO3_A0_u; GPIO2_C7_d; GPIO3_B4_u; I2C4_SDA_M1; GPIO2_C6_d; GPIO3_B3_u; I2C4_SCL_M1; GPIO2_D0_d; GPIO3_B5_u; GMAC0_MDIO; GPIO2_C5_d; GPIO3_A4_d; GMAC0_MDC; GPIO2_C1_d; GPIO3_A3_u; GPIO2_C0_d; GPIO3_A2_u; GPIO2_D2_d; GPIO3_B0_u; GPIO2_D1_d; GPIO3_A7_u; GPIO2_D3_d; GPIO3_B1_d; GPIO2_C2_d; GPIO3_A5_d; MIPI_CSI1_RX_D2N; MIPI_CSI1_RX_D2P; MIPI_CSI1_RX_D3N; MIPI_CSI1_RX_D3P; MIPI_CSI1_RX_CLK1N; MIPI_CSI1_RX_CLK1P
- (in symbol 3588_RIGHT_DOWN) FET3576-C; FET3588-C; SDMMC_D1; 1.8V/3.3V; \; SDMMC_D0; SDMMC_CLK; SDMMC_CMD; SDMMC_D3; SDMMC_D2; 1.8V; SARADC_VIN0; SARADC_VIN1; SARADC_VIN3; SARADC_VIN7; 3.3V; GPIO2_B0_d; GPIO4_B1_u; GPIO2_A7_d; GPIO4_B0_d; GPIO4_B6_d; GPIO4_C0_d; GPIO4_C1_d; GPIO3_A3_d; GPIO4_B2_u; HDMI_TX0_SDA_M0; GPIO3_A2_d; GPIO4_B3_u; HDMI_TX0_SCL_M0; I2C5_SCL_M2; I2C5_SDA_M2; GPIO4_A2_d; GPIO4_A1_d; GPIO2_A6_d; GPIO4_A0_d; USB20_HOST1_DP; USB20_HOST1_DM; TYPEC1_USB20_VBUSDET
- (in symbol 3588_RIGHT_UP) FET3576-C; FET3588-C; \; TYPEC0_USB20_VBUSDET; TYPEC0_OTG_DM; TYPEC0_OTG_DP; TYPEC0_SBU1; TYPEC0_SBU2; 1.8V; MIPI_DPHY0_TX_D0N; MIPI_DPHY0_RX_D0P; MIPI_DPHY0_TX_D0P; MIPI_DPHY0_RX_D0N; MIPI_DPHY0_TX_D1N; MIPI_DPHY0_RX_D1P; MIPI_DPHY0_TX_D1P; MIPI_DPHY0_RX_D1N; MIPI_DPHY0_TX_CLKN; MIPI_DPHY0_RX_CLKP; MIPI_DPHY0_TX_CLKP; MIPI_DPHY0_RX_CLKN; MIPI_DPHY0_TX_D2N; MIPI_DPHY0_RX_D2P; MIPI_DPHY0_TX_D2P; MIPI_DPHY0_RX_D2N; MIPI_DPHY0_TX_D3N; MIPI_DPHY0_RX_D3P; MIPI_DPHY0_TX_D3P; MIPI_DPHY0_RX_D3N; 3.3V; GPIO0_A7_u; GPIO0_A4_u; GPIO0_B0_z; GPIO0_B3_z

### Library data of the parts
C1 C2 = 1110205018: 序号: 747; 存货名称: 贴装叠层陶瓷电容; 规格型号: 1206,22uF,25V,±10％,X5R; 禁用: 否; 近三年购买频次: 近三年购买频次.30; Published: 8-Jun-2000; LatestRevisionDate: 17-Jul-2002; LatestRevisionNote: Re-released for DXP Platform.; PackageReference: RAD-0.3; Publisher: Altium Limited; PackageDescription: Radial Cap, Thru-Hole; 2 Leads; 0.3 in Pin Spacing; Value: 22uF/25V; 存货编码: 1110205018; 最近一次购买记录: 2025/1/10; 料号建立日期: 2019/7/2
C141 = 1110211010: 序号: 4743; 存货名称: 贴装铝电解电容; 规格型号: 220uF,16V,6.3*7.7mm,CS1C221M-CRE77; 禁用: 否; 近三年购买频次: 近三年购买频次.19; Published: 8-Jun-2000; LatestRevisionDate: 17-Jul-2002; LatestRevisionNote: Re-released for DXP Platform.; PackageReference: RB7.6-15; Publisher: Altium Limited; PackageDescription: Polarized Capacitor (Radial); 2 Leads; Value: 220μF/16V_DNP; 存货编码: 1110211010; 最近一次购买记录: 2024/12/25; 料号建立日期: 2022/9/2
R1-R6 R9-R12 = 1110102038: 序号: 58; 存货名称: 贴装电阻; 规格型号: 0402,2.2K,±1％; 禁用: 否; 近三年购买频次（更新至2023/12/7）: 近三年购买频次,47; Value: 2.2K_1%; 存货编码: 1110102038; 最近一次购买记录(更新至20231207）: 2023/11/28; 料号建立日期: 2019/7/2
P1 = 3588_RIGHT_DOWN: Value: 3588_RIGHT_DOWN
P2 = 3588_LEFT_DOWN: Value: 3588_LEFT_DOWN
P3 = 3588_RIGHT_UP: Value: 3588_RIGHT_UP
P4 = 3588_LEFT_UP: Value: 3588_LEFT_UP

## Sheet 03 PWR.SchDoc
size A3; Revision: V1.2; SheetNumber: 3; SheetTotal: 11
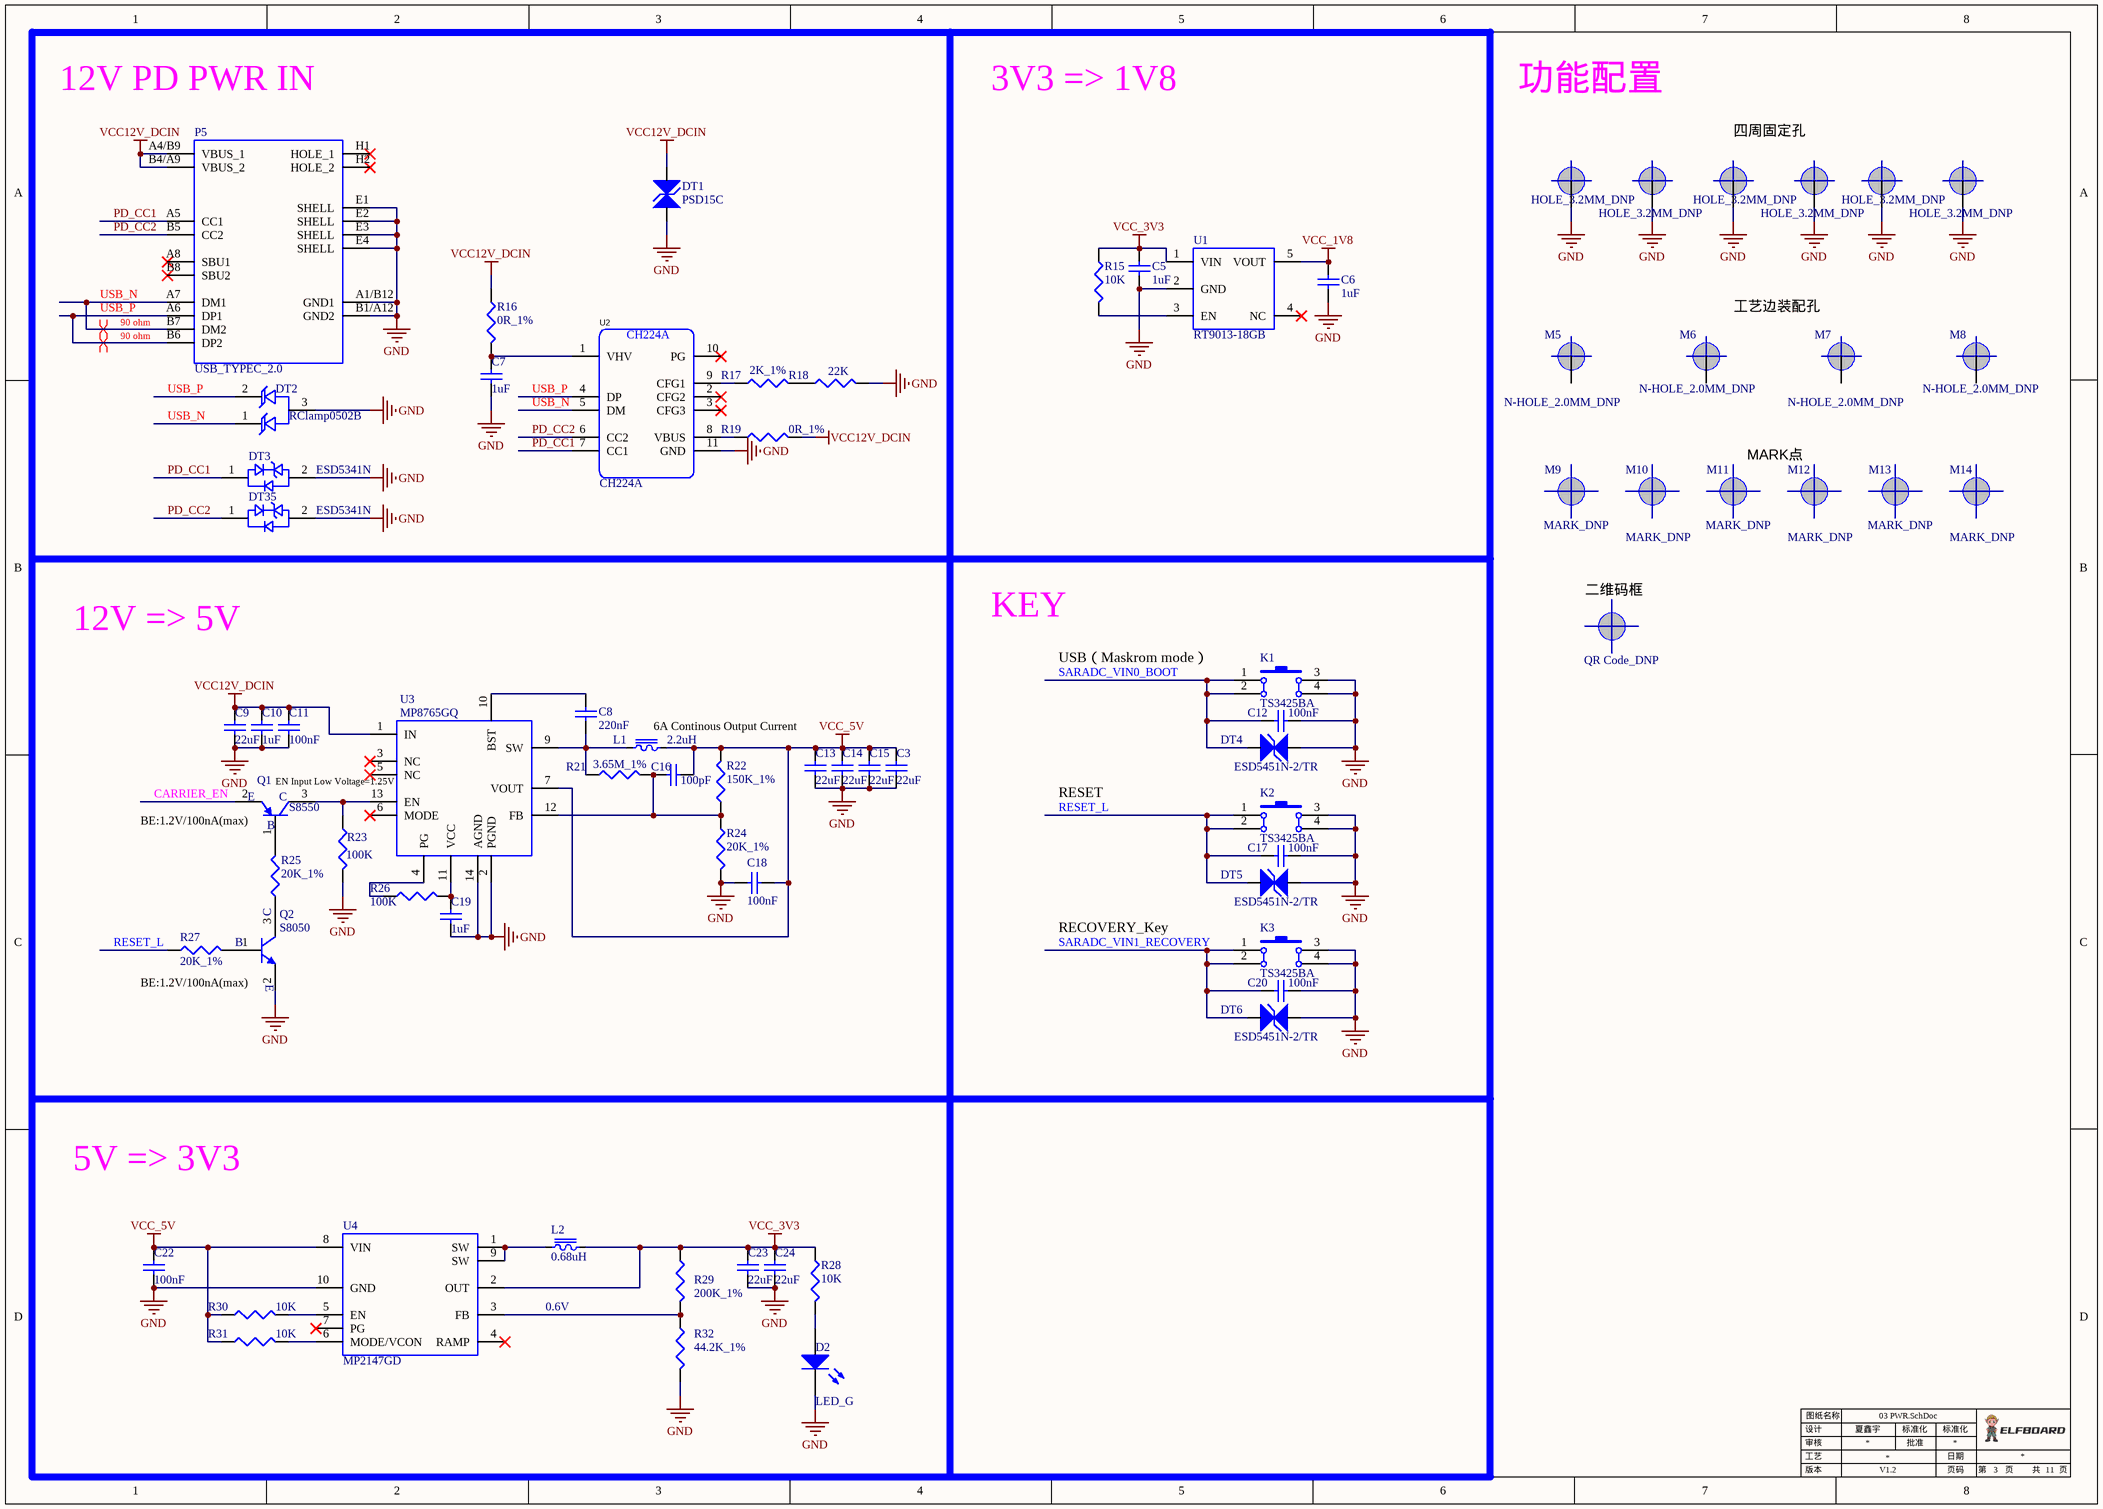
[diagram p5: 03 PWR.SchDoc]

### Parts
C3  22uF  [0805C]
C5  1uF  [0402C]
C6  1uF  [0402C]
C7  1uF  [0402C]
C8  220nF  [0402C]
C9  22uF  [0805C]
C10  1uF  [0603C]
C11  100nF  [0402C]
C12  100nF  [0402C]
C13  22uF  [0805C]
C14  22uF  [0805C]
C15  22uF  [0805C]
C16  100pF  [0402C]
C17  100nF  [0402C]
C18  100nF  [0402C]
C19  1uF  [0402C]
C20  100nF  [0402C]
C22  100nF  [0402C]
C23  22uF  [0805C]
C24  22uF  [0805C]
D2  LED_G  [0603LED_G]
DT1  PSD15C  [SOD_323_D]
DT2  RClamp0502B  [SOT_523]
DT3  ESD5341N  [0402TVS-ESD5341N]
DT4  ESD5451N-2/TR  [0402TVS]
DT5  ESD5451N-2/TR  [0402TVS]
DT6  ESD5451N-2/TR  [0402TVS]
DT35  ESD5341N  [0402TVS-ESD5341N]
K1  TS3425BA  [KEY4-4_6-3_2-H2_5]
K2  TS3425BA  [KEY4-4_6-3_2-H2_5]
K3  TS3425BA  [KEY4-4_6-3_2-H2_5]
L1  2.2uH  [L_4*4*2]
L2  0.68uH  [L_4*4*2]
M1  HOLE_3.2MM_DNP  [HOLE_3.2MM]
M2  HOLE_3.2MM_DNP  [HOLE_3.2MM]
M3  HOLE_3.2MM_DNP  [HOLE_3.2MM]
M4  HOLE_3.2MM_DNP  [HOLE_3.2MM]
M5  N-HOLE_2.0MM_DNP  [N-HOLE_2.0MM]
M6  N-HOLE_2.0MM_DNP  [N-HOLE_2.0MM]
M7  N-HOLE_2.0MM_DNP  [N-HOLE_2.0MM]
M8  N-HOLE_2.0MM_DNP  [N-HOLE_2.0MM]
M9  MARK_DNP  [Mark Point_circle]
M10  MARK_DNP  [Mark Point_circle]
M11  MARK_DNP  [Mark Point_circle]
M12  MARK_DNP  [Mark Point_circle]
M13  MARK_DNP  [Mark Point_circle]
M14  MARK_DNP  [Mark Point_circle]
M15  QR Code_DNP  [QR Code]
M16  HOLE_3.2MM_DNP  [HOLE_3.2MM]
M17  HOLE_3.2MM_DNP  [HOLE_3.2MM]
P5  USB_TYPEC_2.0  [USB_TYPE-C_S]
Q1  S8550  [SOT_233_N]
Q2  S8050  [SOT_233_N]
R15  10K  [0402R]
R16  0R_1%  [0402R]
R17  2K_1%  [0402R]
R18  22K  [0402R]
R19  0R_1%  [0402R]
R21  3.65M_1%  [0603R]
R22  150K_1%  [0402R]
R23  100K  [0402R]
R24  20K_1%  [0402R]
R25  20K_1%  [0402R]
R26  100K  [0402R]
R27  20K_1%  [0402R]
R28  10K  [0402R]
R29  200K_1%  [0402R]
R30  10K  [0402R]
R31  10K  [0402R]
R32  44.2K_1%  [0402R]
U1  RT9013-18GB  [SOT_235]
U2  CH224A  [ESSOP11-1-6X5-H1_8]
U3  MP8765GQ  [QFN16P_MP8765]
U4  MP2147GD  [QFN_2*3]

### Nets
GND: C3.1 C5.1 C6.1 C7.1 C9.1 C10.1 C11.1 C12.1 C13.1 C14.1 C15.1 C17.1 C18.2 C19.1 C20.1 C22.1 C23.1 C24.1 D2.2(K) DT1.1 DT2.3 DT3.2 DT4.2 DT5.2 DT6.2 DT35.2 K1.3 K1.4 K2.3 K2.4 K3.3 K3.4 M1.0(EF) M2.0(EF) M3.0(EF) M4.0(EF) M16.0(EF) M17.0(EF) P5.A1/B12(GND1) P5.B1/A12(GND2) P5.E1(SHELL) P5.E2(SHELL) P5.E3(SHELL) P5.E4(SHELL) Q2.2(E) R18.2 R23.2 R24.2 R32.2 U1.2(GND) U2.11(GND) U3.2(PGND) U3.14(AGND) U4.10(GND)
VCC12V_DCIN: C9.2 C10.2 C11.2 DT1.2 P5.A4/B9(VBUS_1) P5.B4/A9(VBUS_2) R16.1 R19.2 U3.1(IN)
VCC_1V8: C6.2 U1.5(VOUT)
VCC_3V3: C5.2 C23.2 C24.2 L2.2 R15.1 R28.1 R29.1 U1.1(VIN) U4.2(OUT)
VCC_5V: C3.2 C13.2 C14.2 C15.2 C16.2 C18.1 C22.2 L1.2 R22.2 R30.1 R31.1 U3.7(VOUT) U4.8(VIN)
CARRIER_EN: Q1.2(E)
PD_CC1: DT3.1 P5.A5(CC1) U2.7(CC1)
PD_CC2: DT35.1 P5.B5(CC2) U2.6(CC2)
RESET_L: C17.2 DT5.1 K2.1 K2.2 R27.1
SARADC_VIN0_BOOT: C12.2 DT4.1 K1.1 K1.2
SARADC_VIN1_RECOVERY: C20.2 DT6.1 K3.1 K3.2
USB_N: DT2.1 P5.A7(DM1) P5.B7(DM2) U2.5(DM)
USB_P: DT2.2 P5.A6(DP1) P5.B6(DP2) U2.4(DP)
NetC7_2: C7.2 R16.2 U2.1(VHV)
NetC8_1: C8.1 L1.1 R21.1 U3.9(SW)
NetC8_2: C8.2 U3.10(BST)
NetC16_1: C16.1 R21.2 R22.1 R24.1 U3.12(FB)
NetC19_2: C19.2 R26.2 U3.11(VCC)
NetD2_1: D2.1(A) R28.2
NetL2_1: L2.1 U4.1(SW) U4.9(SW)
NetQ1_1: Q1.1(B) R25.2
NetQ1_3: Q1.3(C) R23.1 U3.13(EN)
NetQ2_1: Q2.1(B) R27.2
NetQ2_3: Q2.3(C) R25.1
NetR15_2: R15.2 U1.3(EN)
NetR17_1: R17.1 U2.9(CFG1)
NetR17_2: R17.2 R18.1
NetR19_1: R19.1 U2.8(VBUS)
NetR26_1: R26.1 U3.4(PG)
NetR29_2: R29.2 R32.1 U4.3(FB)
NetR30_2: R30.2 U4.5(EN)
NetR31_2: R31.2 U4.6(MODE/VCON)

Not connected (* = marked no-connect by the designer): M5 0(EF); M6 0(EF); M7 0(EF); M8 0(EF); P5 A8(SBU1)* B8(SBU2)* H1(HOLE_1)* H2(HOLE_2)*; U1 4(NC)*; U2 2(CFG2)* 3(CFG3)* 10(PG)*; U3 3(NC)* 5(NC)* 6(MODE)*; U4 4(RAMP)* 7(PG)*

### Layout directives
differential pair; differential pair class 90 ohm: USB_N, USB_P

### Notes on the sheet
- 12V PD PWR IN
- 3V3 => 1V8
- 功能配置
- 四周固定孔
- 工艺边装配孔
- MARK点
- 12V => 5V
- KEY
- (near M15) 二维码框
- USB（Maskrom mode）
- (near U3) EN Input Low Voltage=1.25V
- (near L1) 6A Continous Output Current
- (near Q1) BE:1.2V/100nA(max)
- RESET
- BE:1.2V/100nA(max)
- RECOVERY_Key
- 5V => 3V3
- 0.6V
- 设计
- 审核
- 工艺
- 图纸名称
- 夏鑫宇
- 批准
- 标准化
- 日期
- 版本
- 页码
- 第
- 页
- 共

### Library data of the parts
C3 C9 C13-C15 = 1110204012: 序号: 747; 存货名称: 贴装叠层陶瓷电容; 规格型号: 0805,22uF,16V,±20％,X5R; 禁用状态: 否; Published: 8-Jun-2000; LatestRevisionDate: 17-Jul-2002; LatestRevisionNote: Re-released for DXP Platform.; PackageReference: RAD-0.3; Publisher: Altium Limited; PackageDescription: Radial Cap, Thru-Hole; 2 Leads; 0.3 in Pin Spacing; Value: 22uF; 存货编码: 1110204012
C5-C7 C19 = 1110202021: 序号: 600; 存货名称: 贴装叠层陶瓷电容; 规格型号: 0402,1uF,16V,±10％,X5R; Published: 8-Jun-2000; LatestRevisionDate: 17-Jul-2002; LatestRevisionNote: Re-released for DXP Platform.; PackageReference: RAD-0.3; Publisher: Altium Limited; PackageDescription: Radial Cap, Thru-Hole; 2 Leads; 0.3 in Pin Spacing; Value: 1uF; 存货编码: 1110202021
C8 = 1110202042: 存货名称: 贴装叠层陶瓷电容; 规格型号: 0402,220nF,25V,±10％,X5R; Published: 8-Jun-2000; LatestRevisionDate: 17-Jul-2002; LatestRevisionNote: Re-released for DXP Platform.; PackageReference: RAD-0.3; Publisher: Altium Limited; PackageDescription: Radial Cap, Thru-Hole; 2 Leads; 0.3 in Pin Spacing; Value: 220nF; 存货编码: 1110202042
C10 = 1110203025: 序号: 648; 存货名称: 贴装叠层陶瓷电容; 规格型号: 0603,1uF,25V,±10％,X5R; 描述: 替代010202065; 禁用: #REF!; 近三年购买频次（更新至2023/12/7）: 近三年购买频次,35; Published: 8-Jun-2000; LatestRevisionDate: 17-Jul-2002; LatestRevisionNote: Re-released for DXP Platform.; PackageReference: RAD-0.3; Publisher: Altium Limited; PackageDescription: Radial Cap, Thru-Hole; 2 Leads; 0.3 in Pin Spacing; Value: 1uF; 存货编码: 1110203025; 最近一次购买记录(更新至20231207）: 2023/10/23; 料号建立日期: 2019/7/2
C11 C12 C17 C18 C20 C22 = 1110202039: 序号: 626; 存货名称: 贴装叠层陶瓷电容; 规格型号: 0402,100nF,25V,±10％,X5R; Published: 8-Jun-2000; LatestRevisionDate: 17-Jul-2002; LatestRevisionNote: Re-released for DXP Platform.; PackageReference: RAD-0.3; Publisher: Altium Limited; PackageDescription: Radial Cap, Thru-Hole; 2 Leads; 0.3 in Pin Spacing; Value: 100nF; 存货编码: 1110202039
C16 = 1110202016: 序号: 587; 存货名称: 贴装叠层陶瓷电容; 规格型号: 0402,100pF,50V,±5％,NPO; Published: 8-Jun-2000; LatestRevisionDate: 17-Jul-2002; LatestRevisionNote: Re-released for DXP Platform.; PackageReference: RAD-0.3; Publisher: Altium Limited; PackageDescription: Radial Cap, Thru-Hole; 2 Leads; 0.3 in Pin Spacing; Value: 100pF; 存货编码: 1110202016
C23 C24 = 1110204012: 序号: 747; 存货名称: 贴装叠层陶瓷电容; 规格型号: 0805,22uF,16V,±20％,X5R; 主计量单位名称: 个; 安全库存: 6299; 旧编码: 010203017; 旧规格型号: 0805 22uF 16V ±20％ X5R; Published: 8-Jun-2000; LatestRevisionDate: 17-Jul-2002; LatestRevisionNote: Re-released for DXP Platform.; PackageReference: RAD-0.3; Publisher: Altium Limited; PackageDescription: Radial Cap, Thru-Hole; 2 Leads; 0.3 in Pin Spacing; Value: 22uF; 存货编码: 1110204012
D2 = 1110504013: 序号: 1825; 存货名称: 贴装发光二极管; 规格型号: 0603,透明,翠绿色发光,普通亮度; 禁用状态: 否; Published: 8-Jun-2000; LatestRevisionDate: 17-Jul-2002; LatestRevisionNote: Re-released for DXP Platform.; PackageVersion: Feb-2002; PackageReference: 3.2X1.6X1.1; Publisher: Altium Limited; PackageDescription: SM LED; 2 Flat Leads; Value: LED_G; 存货编码: 1110504013
DT1 = 1110503088: 序号: 7697; 存货名称: TVS管; 规格型号: PSD15C,SOD-323; 描述: LT品牌,替代1110503028; 禁用: 否; 近三年购买频次: 近三年购买频次.3; Value: PSD15C; 存货编码: 1110503088; 最近一次购买记录: 2025/2/20; 料号建立日期: 2024/12/6
DT2 = 1110503016: 序号: 2598; 存货名称: TVS管; 规格型号: RC1amp0502B SOT-523; 主计量单位名称: 只; 安全库存: 2084.00; 旧编码: 010603010; Value: RClamp0502B; 存货编码: 1110503016; 启用日期: 2013/1/1
DT3 DT35 = 1110503052: 序号: 4824; 存货名称: TVS管; 规格型号: ESD5341N-2/TR,0402TVS; value: ESD5341N-2/TR; 禁用状态: 否; 存货编码: 1110503052
DT4-DT6 = 1110503036: 序号: 1805; 存货名称: TVS管; 规格型号: ESD5451N-2/TR,DFN1006-2L; 禁用状态: 否; Value: ESD5451N-2/TR; 存货编码: 1110503036
K1-K3 = 1120105023: 存货名称: 贴装按键开关; 规格型号: 4P,4.6*3.2*2.5mm,白色,正按; 禁用: 否; Published: 24-Mar-1999; LatestRevisionDate: 17-Jul-2002; LatestRevisionNote: Re-released for DXP Platform.; PackageReference: SPST-2; Publisher: Altium Limited; PackageDescription: Switch; 2 Leads; 存货编码: 1120105023; Value: TS3425BA
L1 = 1110301084: 存货名称: 绕线电感; 规格型号: 2.2uH,4*4*2mm,7.6A,平行焊盘,非屏蔽,WPN4020H2R2MT; 禁用状态: 否; Published: 24-Mar-1999; LatestRevisionDate: 17-Jul-2002; LatestRevisionNote: Re-released for DXP Platform.; PackageReference: AXIAL-0.9; Publisher: Altium Limited; PackageDescription: Axial Device, Thru-Hole; 2 Leads; 0.9 in Pin Spacing; Value: 2.2uH; 存货编码: 1110301084
L2 = 1110301092: 存货名称: 绕线电感; 规格型号: 0.68uH±20%,4*4*2mm,11.1A/7.4A,平行焊盘,非屏蔽,WPN4020HR68MT; 描述栏信息: Sunlord; 禁用状态: 否; Published: 24-Mar-1999; LatestRevisionDate: 17-Jul-2002; LatestRevisionNote: Re-released for DXP Platform.; PackageReference: AXIAL-0.9; Publisher: Altium Limited; PackageDescription: Axial Device, Thru-Hole; 2 Leads; 0.9 in Pin Spacing; Value: 0.68uH; 存货编码: 1110301092
M1-M4 M16 M17 = HOLE_3.2MM_DNP: 序号: 32; 存货编码: 0; Value: HOLE_3.2MM_DNP; 安全库存: 0; 旧编码: MHOLE
M9-M14 = MARK_DNP: 序号: 35; 存货编码: 0; 旧编码: MHOLE; Value: MARK_DNP; 安全库存: 0
P5 = 1120102080: 序号: 8624; 存货名称: 贴装USB座; 规格型号: USB616FC-C2014245,USB2.0,type-c,母座,单层,横卧,16pin,(4个插装脚,脚长1.8),雾面; 描述: 深圳爱特姆; Value: USB_TYPEC_2.0; 存货编码: 1120102080
Q1 = 1110502004: 序号: 1754; 存货名称: 三极管; 规格型号: S8550,SOT23-3,PNP; 禁用: #REF!; 近三年购买频次（更新至2023/12/7）: 近三年购买频次,26; Published: 8-Jun-2000; LatestRevisionDate: 17-Jul-2002; LatestRevisionNote: Re-released for DXP Platform.; PackageReference: TO-226-AA; Publisher: Altium Limited; PackageDescription: TO, Flat Index; 3 In-Line, Axial Leads; Body Dia. 4.8mm; Leads 0.55 x 0.51 mm (max); Code_JEDEC: TO-226-AA; VALUE: S8550; 存货编码: 1110502004; 最近一次购买记录(更新至20231207）: 2023/11/29; 料号建立日期: 2019/7/2
Q2 = 1110502003: 序号: 1753; 存货名称: 三极管; 规格型号: S8050,SOT23-3,NPN; 禁用: #REF!; 近三年购买频次（更新至2023/12/7）: 近三年购买频次,31; Published: 8-Jun-2000; LatestRevisionDate: 17-Jul-2002; LatestRevisionNote: Re-released for DXP Platform.; PackageReference: TO-226-AA; Publisher: Altium Limited; PackageDescription: TO, Flat Index; 3 In-Line, Axial Leads; Body Dia. 4.8mm; Leads 0.55 x 0.51 mm (max); Code_JEDEC: TO-226-AA; VALUE: S8050; 存货编码: 1110502003; 最近一次购买记录(更新至20231207）: 2023/10/19; 料号建立日期: 2019/7/2
R15 R28 R30 R31 = 1110102007: 序号: 17; 存货名称: 贴装电阻; 规格型号: 0402,10K,±5％; Value: 10K; 存货编码: 1110102007
R16 R19 = 1110102255: 序号: 5781; 存货名称: 贴装电阻; 规格型号: 0402,0Ω,±1％,风华; 描述: FH/广东风华高新科技股份有限公司; 禁用: 否; 近三年购买频次: 近三年购买频次.14; Value: 0R_1%; 存货编码: 1110102255; 最近一次购买记录: 2025/2/12; 料号建立日期: 2023/10/16
R17 = 1110102069: 序号: 89; 存货名称: 贴装电阻; 规格型号: 0402,2K,±1％; 禁用: #REF!; 近三年购买频次（更新至2023/12/7）: 近三年购买频次,70; Value: 2K_1%; 存货编码: 1110102069; 最近一次购买记录(更新至20231207）: 2023/11/22; 料号建立日期: 2019/7/2
R18 = 1110102092: 序号: 112; 存货名称: 贴装电阻; 规格型号: 0402,22K,±5％; 禁用: #REF!; 近三年购买频次（更新至2023/12/7）: 近三年购买频次,1; Value: 22K; 存货编码: 1110102092; 最近一次购买记录(更新至20231207）: 2023/11/29; 料号建立日期: 2019/7/2
R21 = 1110103252: 存货名称: 贴装电阻; 规格型号: 0603,3.65M,±1％; 禁用状态: 否; Value: 3.65M_1%; 存货编码: 1110103252
R22 = 1110102061: 序号: 79; 存货名称: 贴装电阻; 规格型号: 0402,150K,±1％; Value: 150K_1%; 存货编码: 1110102061
R23 = 1110102004: 序号: 14; 存货名称: 贴装电阻; 规格型号: 0402,100K,±5％; 主计量单位名称: 只; 安全库存: 129124; 旧编码: 010101005; 旧规格型号: 0402-100K ±5％; Value: 100K; 存货编码: 1110102004
R24 = 1110102074: 序号: 106; 存货名称: 贴装电阻; 规格型号: 0402,20K,±1％; Value: 20K_1%; 存货编码: 1110102074
R25 R27 = 1110102074: 序号: 94; 存货名称: 贴装电阻; 规格型号: 0402,20K,±1％; 禁用: 否; 近三年购买频次（更新至2023/12/7）: 近三年购买频次,3; Value: 20K_1%; 存货编码: 1110102074; 最近一次购买记录(更新至20231207）: 2021/12/27; 料号建立日期: 2019/7/2
R26 = 1110102004: 序号: 14; 存货名称: 贴装电阻; 规格型号: 0402,100K,±5％; Value: 100K; 存货编码: 1110102004
R29 = 1110102049: 序号: 63; 存货名称: 贴装电阻; 规格型号: 0402,200K,±1％; Value: 200K_1%; 存货编码: 1110102049
R32 = 1110102127: 序号: 164; 存货名称: 贴装电阻; 规格型号: 0402,44.2K,±1％; Value: 44.2K_1%; 存货编码: 1110102127
U1 = 1110404097: 序号: 2093; 存货名称: 电源; 规格型号: RT9013-18GB,SOT-23-5; Value: RT9013-18GB; 存货编码: 1110404097
U2 = 1110405668: 序号: 8408; 存货名称: 常规IC; 规格型号: CH224A ESSOP10,PD等多快充协议受电芯片,支持 PD3.2,BC1.2; Value: CH224A; 存货编码: 1110405668
U3 = 1110404112: 存货名称: 电源; 规格型号: MP8765GQ,QFN16; 安全库存: 105; 存货编码: 1110404112; Value: MP8765GQ; 旧规格型号: MP8765GQ,QFN16
U4 = 1110404132: 存货名称: 电源; 规格型号: MP2147GD,QFN2×3mm; Value: MP2147GD; 存货编码: 1110404132
M5-M8 = N-HOLE_2.0MM_DNP: Value: N-HOLE_2.0MM_DNP
M15 = QR Code_DNP: Value: QR Code_DNP

## Sheet 04 Debug&TF card&RTC.SchDoc
size A3; Revision: V1.2; SheetNumber: 4; SheetTotal: 11
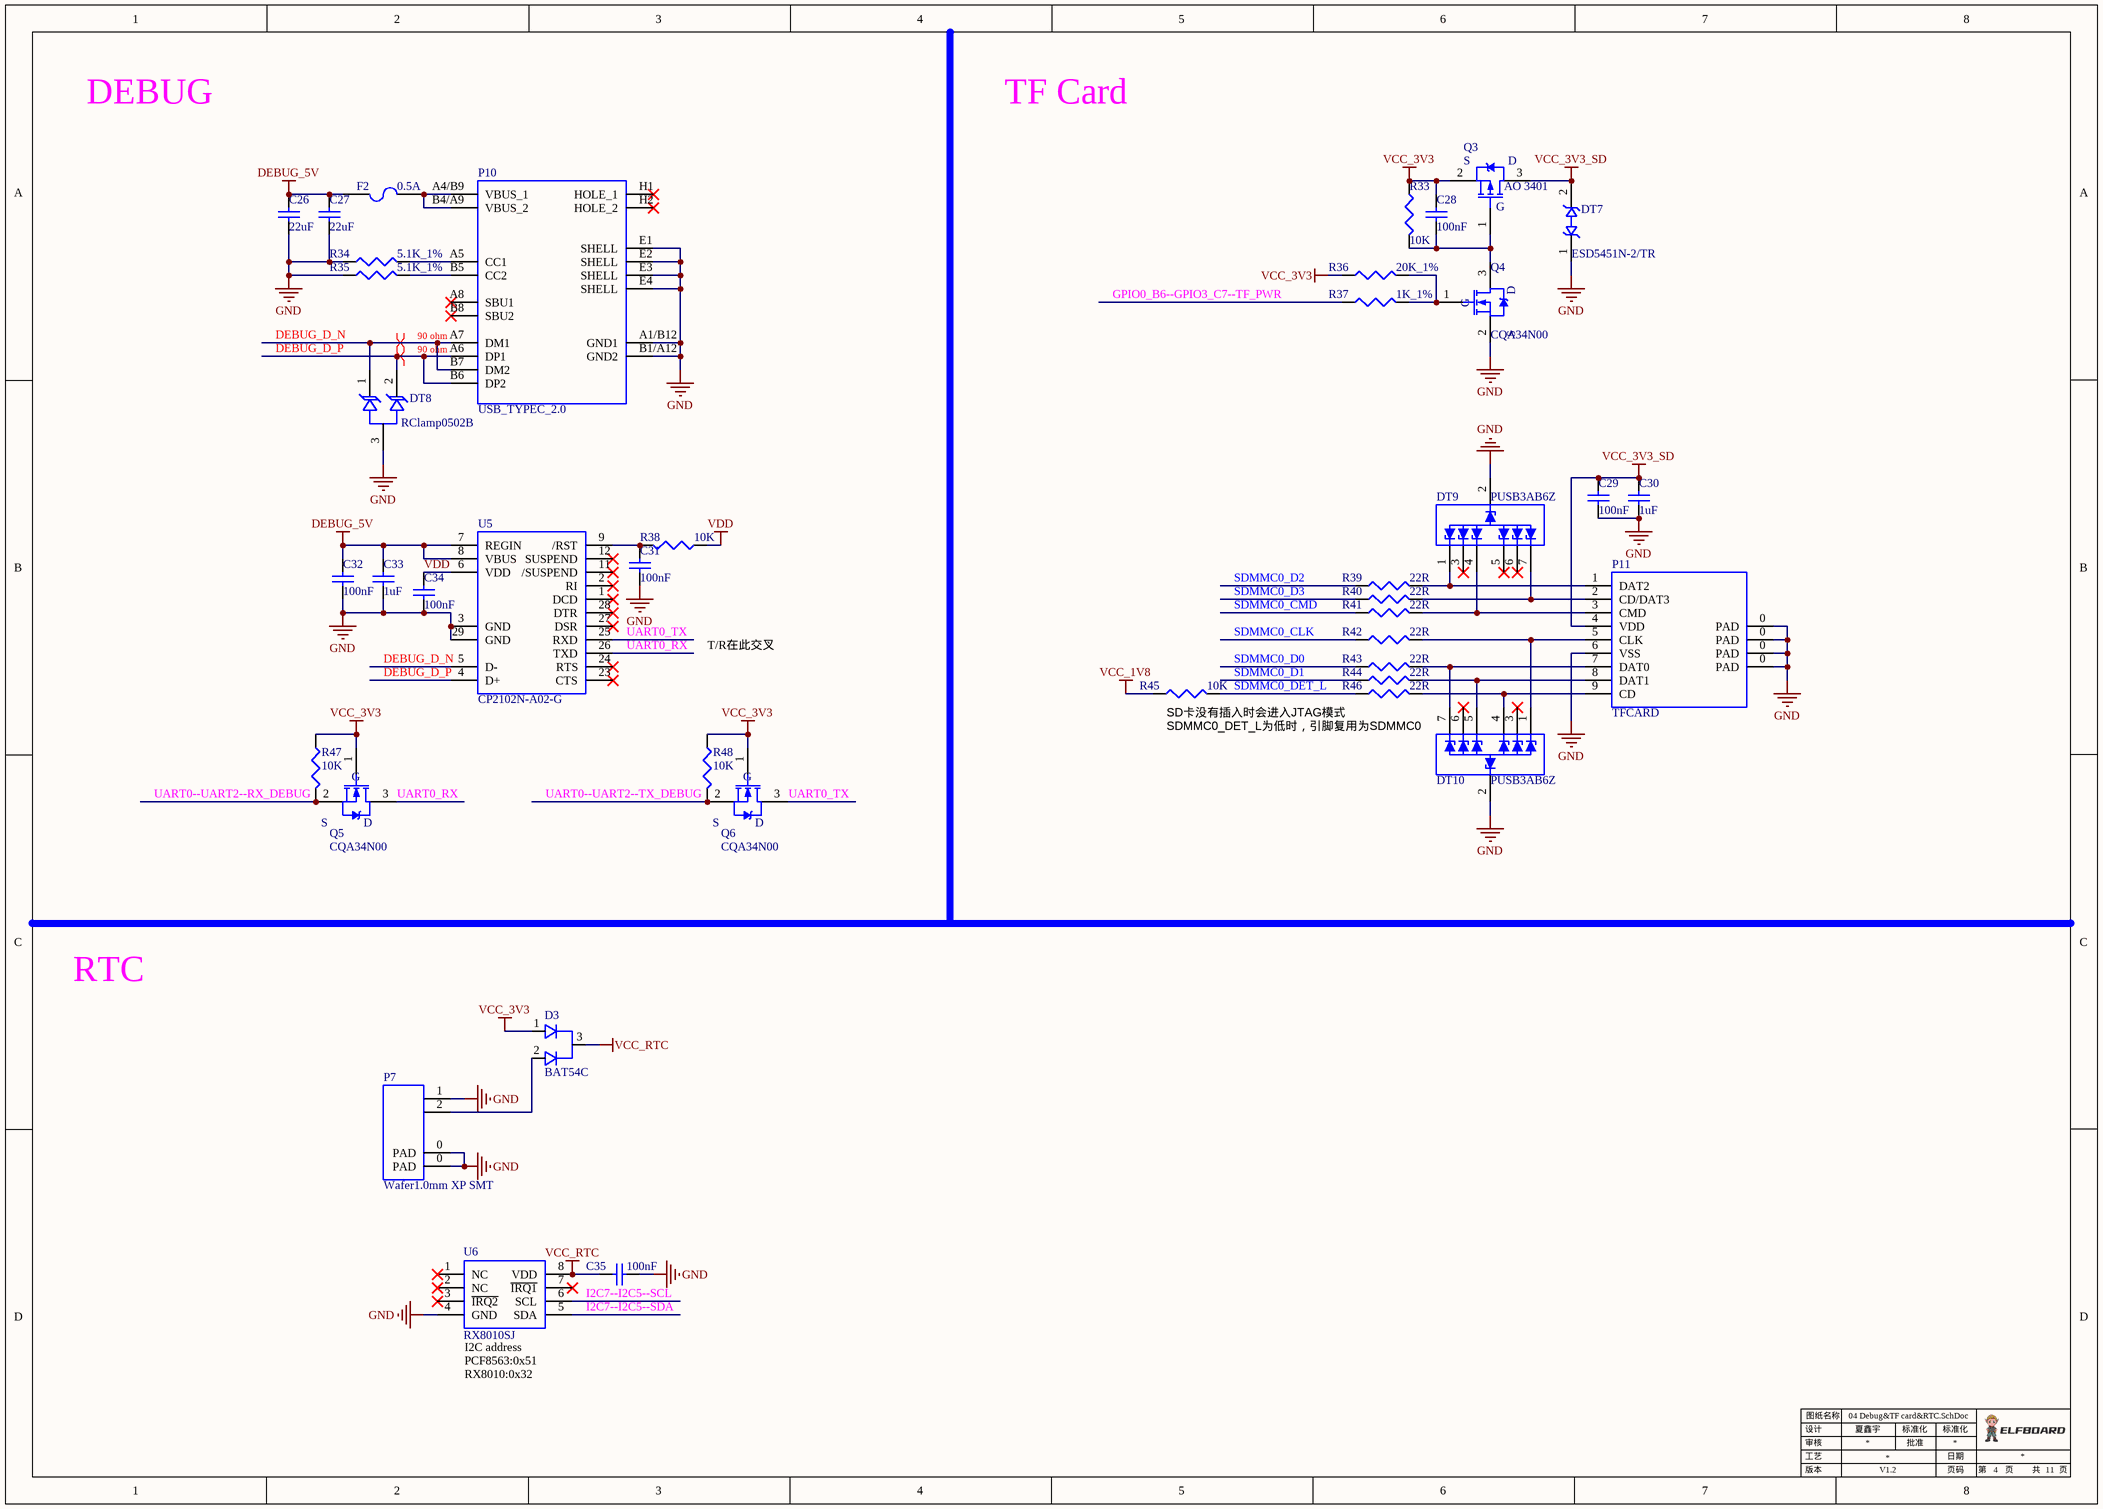
[diagram p6: 04 Debug&TF card&RTC.SchDoc]

### Parts
C26  22uF  [0603C]
C27  22uF  [0603C]
C28  100nF  [0402C]
C29  100nF  [0402C]
C30  1uF  [0402C]
C31  100nF  [0402C]
C32  100nF  [0402C]
C33  1uF  [0402C]
C34  100nF  [0402C]
C35  100nF  [0402C]
D3  BAT54C  [SOT_233_N]
DT7  ESD5451N-2/TR  [0402TVS]
DT8  RClamp0502B  [SOT_523]
DT9  PUSB3AB6Z  [DFN2111-7]
DT10  PUSB3AB6Z  [DFN2111-7]
F2  0.5A  [1210F]
P7  Wafer1.0mm XP SMT  [CON2-1-4X3_1-H4_3]
P10  USB_TYPEC_2.0  [USB_TYPE-C_S]
P11  TFCARD  [TF_CARD_SELF]
Q3  AO 3401  [SOT_233_W]
Q4  CQA34N00  [SOT_233_W]
Q5  CQA34N00  [SOT_233_W]
Q6  CQA34N00  [SOT_233_W]
R33  10K  [0402R]
R34  5.1K_1%  [0402R]
R35  5.1K_1%  [0402R]
R36  20K_1%  [0402R]
R37  1K_1%  [0402R]
R38  10K  [0402R]
R39  22R  [0402R]
R40  22R  [0402R]
R41  22R  [0402R]
R42  22R  [0402R]
R43  22R  [0402R]
R44  22R  [0402R]
R45  10K  [0402R]
R46  22R  [0402R]
R47  10K  [0402R]
R48  10K  [0402R]
U5  CP2102N-A02-G  [QFN28P_0.5BSC_5*5_H]
U6  RX8010SJ  [SOP8_1.27-7.2x4-h2.65]

### Nets
DEBUG_5V: C26.2 C27.2 C32.2 C33.2 F2.2 U5.7(REGIN) U5.8(VBUS)
GND: C26.1 C27.1 C29.1 C30.1 C31.1 C32.1 C33.1 C34.1 C35.2 DT7.1 DT8.3 DT9.2 DT10.2 P7.0(PAD) P7.1 P10.A1/B12(GND1) P10.B1/A12(GND2) P10.E1(SHELL) P10.E2(SHELL) P10.E3(SHELL) P10.E4(SHELL) P11.0(PAD) P11.6(VSS) Q4.2(S) R34.1 R35.1 U5.3(GND) U5.29(GND) U6.4(GND)
VCC_1V8: R45.1
VCC_3V3: C28.2 D3.1 Q3.2(S) Q5.1(G) Q6.1(G) R33.1 R36.1 R47.1 R48.1
VCC_3V3_SD: C29.2 C30.2 DT7.2 P11.4(VDD) Q3.3(D)
VCC_RTC: C35.1 D3.3 U6.8(VDD)
VDD: C34.2 R38.1 U5.6(VDD)
DEBUG_D_N: DT8.1 P10.A7(DM1) P10.B7(DM2) U5.5(D-)
DEBUG_D_P: DT8.2 P10.A6(DP1) P10.B6(DP2) U5.4(D+)
GPIO0_B6--GPIO3_C7--TF_PWR: R37.1
I2C7--I2C5--SCL: U6.6(SCL)
I2C7--I2C5--SDA: U6.5(SDA)
SDMMC0_CLK: R42.1
SDMMC0_CMD: R41.1
SDMMC0_D0: R43.1
SDMMC0_D1: R44.1
SDMMC0_D2: R39.1
SDMMC0_D3: R40.1
SDMMC0_DET_L: R45.2 R46.1
UART0--UART2--RX_DEBUG: Q5.2(S) R47.2
UART0--UART2--TX_DEBUG: Q6.2(S) R48.2
UART0_RX: Q5.3(D) U5.26(TXD)
UART0_TX: Q6.3(D) U5.25(RXD)
NetC28_1: C28.1 Q3.1(G) Q4.3(D) R33.2
NetC31_2: C31.2 R38.2 U5.9(/RST)
NetD3_2: D3.2 P7.2
NetDT9_1: DT9.1 P11.1(DAT2) R39.2
NetDT9_4: DT9.4 P11.3(CMD) R41.2
NetDT9_7: DT9.7 P11.2(CD/DAT3) R40.2
NetDT10_1: DT10.1 P11.5(CLK) R42.2
NetDT10_4: DT10.4 P11.9(CD) R46.2
NetDT10_5: DT10.5 P11.8(DAT1) R44.2
NetDT10_7: DT10.7 P11.7(DAT0) R43.2
NetF2_1: F2.1 P10.A4/B9(VBUS_1) P10.B4/A9(VBUS_2)
NetP10_A5: P10.A5(CC1) R34.2
NetP10_B5: P10.B5(CC2) R35.2
NetQ4_1: Q4.1(G) R36.2 R37.2

Not connected (* = marked no-connect by the designer): DT9 3* 5* 6*; DT10 3* 6*; P10 A8(SBU1)* B8(SBU2)* H1(HOLE_1)* H2(HOLE_2)*; U5 1(DCD)* 2(RI)* 11(/SUSPEND)* 12(SUSPEND)* 23(CTS)* 24(RTS)* 27(DSR)* 28(DTR)*; U6 1(NC)* 2(NC)* 3(~{IRQ2})* 7(~{IRQ1})*

### Layout directives
differential pair; differential pair class 90 ohm: DEBUG_D_N, DEBUG_D_P

### Notes on the sheet
- DEBUG
- TF Card
- T/R在此交叉
- (near R45) SD卡没有插入时会进入JTAG模式
- (near R45) SDMMC0_DET_L为低时，引脚复用为SDMMC0
- RTC
- (near U6) PCF8563:0x51
- (near U6) I2C address
- RX8010:0x32
- 设计
- 审核
- 工艺
- 图纸名称
- 夏鑫宇
- 批准
- 标准化
- 日期
- 版本
- 页码
- 第
- 页
- 共

### Library data of the parts
C26 C27 = 1110203040: 序号: 675; 存货名称: 贴装叠层陶瓷电容; 规格型号: 0603,22uF,6.3V,±20％,X5R; 主计量单位名称: 个; 安全库存: 678357; 旧编码: 010202048; 旧规格型号: 0603 22uF 6.3V ±20％ X5R; Published: 8-Jun-2000; LatestRevisionDate: 17-Jul-2002; LatestRevisionNote: Re-released for DXP Platform.; PackageReference: RAD-0.3; Publisher: Altium Limited; PackageDescription: Radial Cap, Thru-Hole; 2 Leads; 0.3 in Pin Spacing; Value: 22uF; 存货编码: 1110203040
C28 C29 C35 = 1110202039: as C11 on sheet 03 PWR; Published: 8-Jun-2000; LatestRevisionDate: 17-Jul-2002; LatestRevisionNote: Re-released for DXP Platform.; PackageReference: RAD-0.3; Publisher: Altium Limited; PackageDescription: Radial Cap, Thru-Hole; 2 Leads; 0.3 in Pin Spacing; Value: 100nF; 存货编码: 1110202039
C30 C33 = 1110202002: 序号: 571; 存货名称: 贴装叠层陶瓷电容; 规格型号: 0402,1uF,10V,±10％,X5R; 主计量单位名称: 个; 安全库存: 499709; 旧编码: 010201002; 旧规格型号: 0402 1uF 10V ±10％ X5R; Published: 8-Jun-2000; LatestRevisionDate: 17-Jul-2002; LatestRevisionNote: Re-released for DXP Platform.; PackageReference: RAD-0.3; Publisher: Altium Limited; PackageDescription: Radial Cap, Thru-Hole; 2 Leads; 0.3 in Pin Spacing; Value: 1uF; 存货编码: 1110202002
C31 C32 C34 = 1110202001: 序号: 570; 存货名称: 贴装叠层陶瓷电容; 规格型号: 0402,100nF,16V,±10％,X7R; 主计量单位名称: 个; 安全库存: 2580445; 旧编码: 010201001; 旧规格型号: 0402 100nF 16V ±10％ X7R; Published: 8-Jun-2000; LatestRevisionDate: 17-Jul-2002; LatestRevisionNote: Re-released for DXP Platform.; PackageReference: RAD-0.3; Publisher: Altium Limited; PackageDescription: Radial Cap, Thru-Hole; 2 Leads; 0.3 in Pin Spacing; Value: 100nF; 存货编码: 1110202001
D3 = 1110501005: 序号: 2485; 存货名称: 双肖特基二极管; 规格型号: BAT54C,SOT-23-3; 安全库存: 3634; 旧编码: 010601007; 旧规格型号: BAT54C，SOT-23-3; Value: BAT54C; 存货编码: 1110501005
DT7 = 1110503036: 存货名称: TVS管; 规格型号: ESD5451N-2/TR,DFN1006-2L; Value: ESD5451N-2/TR; 存货编码: 1110503036
DT8 = 1110503016: as DT2 on sheet 03 PWR; Value: RClamp0502B; 存货编码: 1110503016; 启用日期: 2013/1/1
DT9 DT10 = 1110503004: 序号: 2555; 存货名称: TVS管; 规格型号: PUSB3AB6Z,xson7; 主计量单位名称: 只; 安全库存: 198; 旧编码: 010601080; 旧规格型号: PUSB3AB6Z xson7; 存货编码: 1110503004; Value: PUSB3AB6Z
F2 = 1110305006: 序号: 3432; 存货名称: 自恢复保险; 规格型号: 1210，0.5A; 主计量单位名称: 个; 安全库存: 4426.00; 旧编码: 010803008; Published: 8-Jun-2000; LatestRevisionDate: 17-Jul-2002; LatestRevisionNote: Re-released for DXP Platform.; PackageReference: PIN-W2/E2.8; Publisher: Altium Limited; PackageDescription: Thru-Hole; 2 Leads; 存货编码: 1110305006; Value: 0.5A; 启用日期: 2013/1/1
P7 = 1120101221: 存货名称: 贴装连接器; 规格型号: Wafer 镀锡,单排,母座,2P,1.0mm,卧贴-WF10002-01206; Value: Wafer1.0mm XP SMT; 存货编码: 1120101221
P10 = 1120102080: as P5 on sheet 03 PWR; Value: USB_TYPEC_2.0; 存货编码: 1120102080
P11 = 1120104005: 序号: 2224; 存货名称: 贴装TF卡座; 规格型号: TFP09-2-12B,自弹式单弹,外焊; 禁用状态: 否; 存货编码: 1120104005; value: TFCARD
Q3 = 1110505061: Note: Pin 2 is electrically connected to pin 4.; 序号: 8103; 存货名称: 场效应管; 规格型号: AO3401A,SOT-23-3,P沟道; 描述: 替代1110505019，AOS（美国万代）; 近三年购买频次: 近三年购买频次.2; Published: 8-Jun-2000; LatestRevisionDate: 17-Jul-2002; LatestRevisionNote: Re-released for DXP Platform.; DatasheetVersion: PD-9.814; PackageVersion: Feb-1997; PackageReference: TO-220AB; Publisher: Altium Limited; PackageDescription: TO, Thru-Hole, Vertical, Heatsink Mounted; 3 In-Line Leads; Pitch 2.54 mm; ComponentLink1Description: Manufacturer Link; ComponentLink1URL: http://www.irf.com/; VALUE: AO 3401; 存货编码: 1110505061; 最近一次购买记录: 2025/2/18
Q4-Q6 = 1110505035: Note: Pin 2 is electrically connected to pin 4.; 序号: 5012; 存货名称: 场效应管; 规格型号: CQA34N00,SOT23,N沟道; 描述: 替代1110505027; 禁用状态: 否; Published: 8-Jun-2000; LatestRevisionDate: 17-Jul-2002; LatestRevisionNote: Re-released for DXP Platform.; DatasheetVersion: PD-9.814; PackageVersion: Feb-1997; PackageReference: TO-220AB; Publisher: Altium Limited; PackageDescription: TO, Thru-Hole, Vertical, Heatsink Mounted; 3 In-Line Leads; Pitch 2.54 mm; VALUE: CQA34N00; 存货编码: 1110505035
R33 R38 R45 R47 R48 = 1110102007: 序号: 17; 存货名称: 贴装电阻; 规格型号: 0402,10K,±5％; Value: 10K; 存货编码: 1110102007
R34 R35 = 1110102136: 存货名称: 贴装电阻; 规格型号: 0402,5.1K,±1％; Value: 5.1K_1%; 存货编码: 1110102136
R36 = 1110102074: 序号: 106; 存货名称: 贴装电阻; 规格型号: 0402,20K,±1％; Value: 20K_1%; 存货编码: 1110102074
R37 = 1110102011: 序号: 21; 存货名称: 贴装电阻; 规格型号: 0402,1K,±1％; Value: 1K_1%; 存货编码: 1110102011
R39-R44 R46 = 1110102028: 序号: 41; 存货名称: 贴装电阻; 规格型号: 0402,22Ω,±5％; Value: 22R; 存货编码: 1110102028
U5 = 1110405282: 序号: 1643; 存货名称: 常规IC; 规格型号: CP2102N-A02-G,QFN28; 描述: 替代1110405210; 禁用状态: 否; Value: CP2102N-A02-G; 存货编码: 1110405282
U6 = 1110405188: 序号: 1549; 存货名称: 常规IC; 规格型号: RX8010SJ,SO-8; 描述: 不推荐新品设计使用,1110405328改版替代,爱普生 时钟模块; 禁用状态: 否; Value: RX8010SJ; 存货编码: 1110405188

## Sheet 05 Ethernet.SchDoc
size A3; Revision: V1.2; SheetNumber: 5; SheetTotal: 11
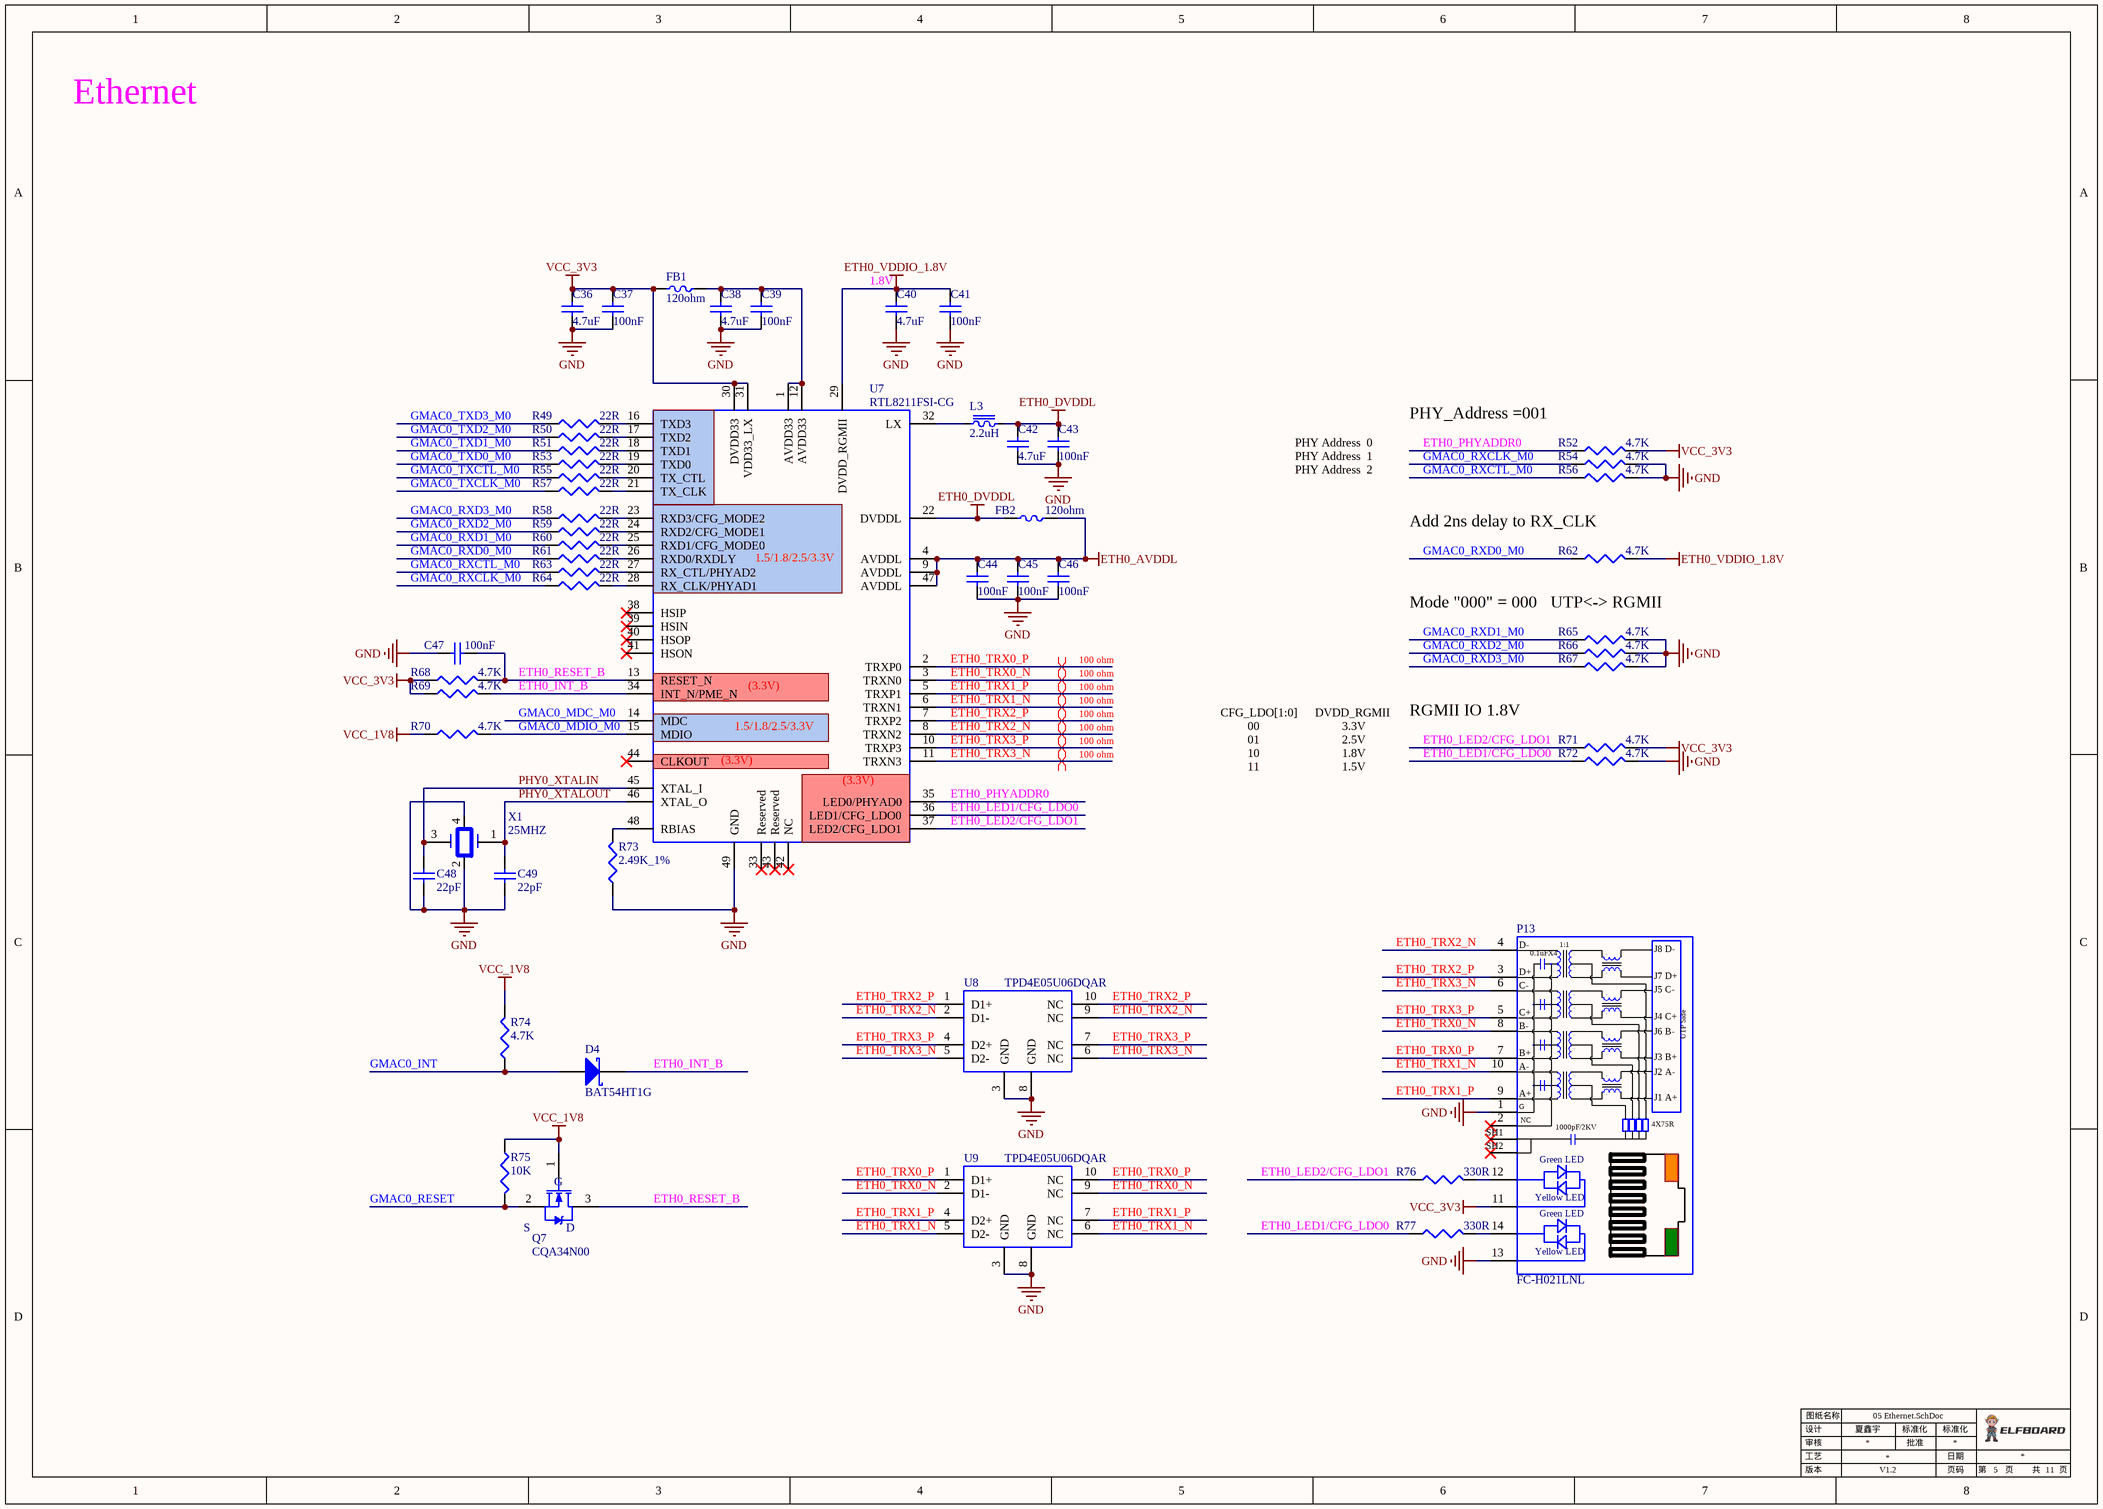
[diagram p7: 05 Ethernet.SchDoc]

### Parts
C36  4.7uF  [0402C]
C37  100nF  [0402C]
C38  4.7uF  [0402C]
C39  100nF  [0402C]
C40  4.7uF  [0402C]
C41  100nF  [0402C]
C42  4.7uF  [0402C]
C43  100nF  [0402C]
C44  100nF  [0402C]
C45  100nF  [0402C]
C46  100nF  [0402C]
C47  100nF  [0402C]
C48  22pF  [0402C]
C49  22pF  [0402C]
D4  BAT54HT1G  [SOD_323]
FB1  120ohm  [0603L]
FB2  120ohm  [0603L]
L3  2.2uH  [L_2.1*1.6]
P13  FC-H021LNL  [RJ45_Gigabit]
Q7  CQA34N00  [SOT_233_W]
R49  22R  [0402R]
R50  22R  [0402R]
R51  22R  [0402R]
R52  4.7K  [0402R]
R53  22R  [0402R]
R54  4.7K  [0402R]
R55  22R  [0402R]
R56  4.7K  [0402R]
R57  22R  [0402R]
R58  22R  [0402R]
R59  22R  [0402R]
R60  22R  [0402R]
R61  22R  [0402R]
R62  4.7K  [0402R]
R63  22R  [0402R]
R64  22R  [0402R]
R65  4.7K  [0402R]
R66  4.7K  [0402R]
R67  4.7K  [0402R]
R68  4.7K  [0402R]
R69  4.7K  [0402R]
R70  4.7K  [0402R]
R71  4.7K  [0402R]
R72  4.7K  [0402R]
R73  2.49K_1%  [0402R]
R74  4.7K  [0402R]
R75  10K  [0402R]
R76  330R  [0402R]
R77  330R  [0402R]
U7  RTL8211FSI-CG  [QFN48-0_4-6X6-PH1_0]
U8  TPD4E05U06DQAR  [USON-10]
U9  TPD4E05U06DQAR  [USON-10]
X1  25MHZ  [Crystals_3225]

### Nets
ETH0_AVDDL: C44.2 C45.2 C46.2 FB2.2 U7.4(AVDDL) U7.9(AVDDL) U7.47(AVDDL)
ETH0_DVDDL: C42.2 C43.2 FB2.1 L3.2 U7.22(DVDDL)
ETH0_VDDIO_1.8V: C40.2 C41.2 R62.2 U7.29(DVDD_RGMII)
GND: C36.1 C37.1 C38.1 C39.1 C40.1 C41.1 C42.1 C43.1 C44.1 C45.1 C46.1 C47.1 C48.1 C49.1 P13.1(GND) P13.13 R54.2 R56.2 R65.2 R66.2 R67.2 R72.2 R73.1 U7.49(GND) U8.3(GND) U8.8(GND) U9.3(GND) U9.8(GND) X1.2 X1.4
VCC_1V8: Q7.1(G) R70.1 R74.2 R75.1
VCC_3V3: C36.2 C37.2 FB1.1 P13.11 R52.2 R68.1 R69.1 R71.2 U7.30(DVDD33) U7.31(VDD33_LX)
ETH0_INT_B: D4.2(K) R69.2 U7.34(INT_N/PME_N)
ETH0_LED1/CFG_LDO0: R72.1 R77.1 U7.36(LED1/CFG_LDO0)
ETH0_LED2/CFG_LDO1: R71.1 R76.1 U7.37(LED2/CFG_LDO1)
ETH0_PHYADDR0: R52.1 U7.35(LED0/PHYAD0)
ETH0_RESET_B: C47.2 Q7.3(D) R68.2 U7.13(RESET_N)
ETH0_TRX0_N: P13.8(B-) U7.3(TRXN0) U9.2(D1-) U9.9(NC)
ETH0_TRX0_P: P13.7(B+) U7.2(TRXP0) U9.1(D1+) U9.10(NC)
ETH0_TRX1_N: P13.10(A-) U7.6(TRXN1) U9.5(D2-) U9.6(NC)
ETH0_TRX1_P: P13.9(A+) U7.5(TRXP1) U9.4(D2+) U9.7(NC)
ETH0_TRX2_N: P13.4(D-) U7.8(TRXN2) U8.2(D1-) U8.9(NC)
ETH0_TRX2_P: P13.3(D+) U7.7(TRXP2) U8.1(D1+) U8.10(NC)
ETH0_TRX3_N: P13.6(C-) U7.11(TRXN3) U8.5(D2-) U8.6(NC)
ETH0_TRX3_P: P13.5(C+) U7.10(TRXP3) U8.4(D2+) U8.7(NC)
GMAC0_INT: D4.1(A) R74.1
GMAC0_MDC_M0: U7.14(MDC)
GMAC0_MDIO_M0: R70.2 U7.15(MDIO)
GMAC0_RESET: Q7.2(S) R75.2
GMAC0_RXCLK_M0: R54.1 R64.1
GMAC0_RXCTL_M0: R56.1 R63.1
GMAC0_RXD0_M0: R61.1 R62.1
GMAC0_RXD1_M0: R60.1 R65.1
GMAC0_RXD2_M0: R59.1 R66.1
GMAC0_RXD3_M0: R58.1 R67.1
GMAC0_TXCLK_M0: R57.1
GMAC0_TXCTL_M0: R55.1
GMAC0_TXD0_M0: R53.1
GMAC0_TXD1_M0: R51.1
GMAC0_TXD2_M0: R50.1
GMAC0_TXD3_M0: R49.1
PHY0_XTALIN: C48.2 U7.45(XTAL_I) X1.3
PHY0_XTALOUT: C49.2 U7.46(XTAL_O) X1.1
NetC38_2: C38.2 C39.2 FB1.2 U7.1(AVDD33) U7.12(AVDD33)
NetL3_1: L3.1 U7.32(LX)
NetP13_12: P13.12 R76.2
NetP13_14: P13.14 R77.2
NetR49_2: R49.2 U7.16(TXD3)
NetR50_2: R50.2 U7.17(TXD2)
NetR51_2: R51.2 U7.18(TXD1)
NetR53_2: R53.2 U7.19(TXD0)
NetR55_2: R55.2 U7.20(TX_CTL)
NetR57_2: R57.2 U7.21(TX_CLK)
NetR58_2: R58.2 U7.23(RXD3/CFG_MODE2)
NetR59_2: R59.2 U7.24(RXD2/CFG_MODE1)
NetR60_2: R60.2 U7.25(RXD1/CFG_MODE0)
NetR61_2: R61.2 U7.26(RXD0/RXDLY)
NetR63_2: R63.2 U7.27(RX_CTL/PHYAD2)
NetR64_2: R64.2 U7.28(RX_CLK/PHYAD1)
NetR73_2: R73.2 U7.48(RBIAS)

Not connected (* = marked no-connect by the designer): P13 2(NC)* SH1* SH2*; U7 33(Reserved)* 38(HSIP)* 39(HSIN)* 40(HSOP)* 41(HSON)* 42(NC)* 43(Reserved)* 44(CLKOUT)*

### Layout directives
differential pair; differential pair class 100 ohm: ETH0_TRX0_N, ETH0_TRX0_P, ETH0_TRX1_N, ETH0_TRX1_P, ETH0_TRX2_N, ETH0_TRX2_P, ETH0_TRX3_N, ETH0_TRX3_P

### Notes on the sheet
- Ethernet
- (near C40) 1.8V
- PHY Address  0
- PHY_Address =001
- PHY Address  1
- PHY Address  2
- Add 2ns delay to RX_CLK
- Mode "000" = 000   UTP<-> RGMII
- CFG_LDO[1:0]
- DVDD_RGMII
- RGMII IO 1.8V
- 00
- 01
- 10
- 11
- 3.3V
- 2.5V
- 1.8V
- 1.5V
- 设计
- 审核
- 工艺
- 图纸名称
- 夏鑫宇
- 批准
- 标准化
- 日期
- 版本
- 页码
- 第
- 页
- 共
- (in symbol 1110405363) 1.5/1.8/2.5/3.3V; (3.3V)
- (in symbol 1120202201) 1:1; 0.1uFX4; J8 D-; J7 D+; J5 C-; J4 C+; J6 B-; UTP Side; J3 B+; J2 A-; J1 A+; G; 1000pF/2KV; 4X75R; Green LED; Yellow LED

### Library data of the parts
C36 C38 C40 C42 = 1110202032: 序号: 616; 存货名称: 贴装叠层陶瓷电容; 规格型号: 0402,4.7uF,10V,±10％,X5R; Published: 8-Jun-2000; LatestRevisionDate: 17-Jul-2002; LatestRevisionNote: Re-released for DXP Platform.; PackageReference: RAD-0.3; Publisher: Altium Limited; PackageDescription: Radial Cap, Thru-Hole; 2 Leads; 0.3 in Pin Spacing; Value: 4.7uF; 存货编码: 1110202032
C37 C39 C41 C43-C47 = 1110202039: as C11 on sheet 03 PWR; Published: 8-Jun-2000; LatestRevisionDate: 17-Jul-2002; LatestRevisionNote: Re-released for DXP Platform.; PackageReference: RAD-0.3; Publisher: Altium Limited; PackageDescription: Radial Cap, Thru-Hole; 2 Leads; 0.3 in Pin Spacing; Value: 100nF; 存货编码: 1110202039
C48 C49 = 1110202003: 序号: 572; 存货名称: 贴装叠层陶瓷电容; 规格型号: 0402,22pF,50V,±5％,NPO; 禁用状态: 否; Published: 8-Jun-2000; LatestRevisionDate: 17-Jul-2002; LatestRevisionNote: Re-released for DXP Platform.; PackageReference: RAD-0.3; Publisher: Altium Limited; PackageDescription: Radial Cap, Thru-Hole; 2 Leads; 0.3 in Pin Spacing; Value: 22pF; 存货编码: 1110202003
D4 = 1110501028: 序号: 2525; 存货名称: 肖特基二极管; 规格型号: BAT54HT1G,SOD323; Published: 8-Jun-2000; LatestRevisionDate: 17-Jul-2002; LatestRevisionNote: Re-released for DXP Platform.; PackageReference: SMB; Publisher: Altium Limited; PackageDescription: DO-214-AA/SMB; 2 C-Bend Leads; Body 5.3 x 3.6 mm, inc. leads (LxW); Code_JEDEC: DO-214-AA; 存货编码: 1110501028; Value: BAT54HT1G
FB1 = 1110304011: 序号: 1028; 存货名称: 磁珠; 规格型号: 0603,120ohm,500mA,WLCB1608-120Ω; VALUE: 120ohm; 存货编码: 1110304011
FB2 = 1110304011: 序号: 1028; 存货名称: 磁珠; 规格型号: 0603，120ohm; 主计量单位名称: 只; 安全库存: 12837.00; 旧编码: 010301092; VALUE: 120ohm; 存货编码: 1110304011; 启用日期: 2015/3/11
L3 = 1110301085: 序号: 948; 存货名称: 绕线电感; 规格型号: 2.2uH,2*1.6*1mm,2.15A,平行焊盘,非屏蔽,WPN201610H2R2MT; 禁用状态: 否; Published: 24-Mar-1999; LatestRevisionDate: 17-Jul-2002; LatestRevisionNote: Re-released for DXP Platform.; PackageReference: AXIAL-0.9; Publisher: Altium Limited; PackageDescription: Axial Device, Thru-Hole; 2 Leads; 0.9 in Pin Spacing; Value: 2.2uH; 存货编码: 1110301085
P13 = 1120202201: 存货名称: 插装网口座; 规格型号: HR851178A,RJ45,1000M,带灯,带变压器,无外围弹片,汉仁; 描述: 改外观替代1120202071; 禁用: 否; VALUE: FC-H021LNL; 存货编码: 1120202201
Q7 = 1110505035: as Q4 on sheet 04 Debug&TF card&RTC; Published: 8-Jun-2000; LatestRevisionDate: 17-Jul-2002; LatestRevisionNote: Re-released for DXP Platform.; DatasheetVersion: PD-9.814; PackageVersion: Feb-1997; PackageReference: TO-220AB; Publisher: Altium Limited; PackageDescription: TO, Thru-Hole, Vertical, Heatsink Mounted; 3 In-Line Leads; Pitch 2.54 mm; VALUE: CQA34N00; 存货编码: 1110505035
R49-R51 R53 R55 R57-R61 R63 R64 = 1110102028: 序号: 41; 存货名称: 贴装电阻; 规格型号: 0402,22Ω,±5％; Value: 22R; 存货编码: 1110102028
R52 R54 R56 R62 R65-R72 R74 = 1110102003: 序号: 12; 存货名称: 贴装电阻; 规格型号: 0402,4.7K,±5％; Value: 4.7K; 存货编码: 1110102003
R73 = 1110102182: 存货名称: 贴装电阻; 规格型号: 0402,2.49K,±1％; 描述栏信息: 厚声; Value: 2.49K_1%; 存货编码: 1110102182
R75 = 1110102007: 序号: 17; 存货名称: 贴装电阻; 规格型号: 0402,10K,±5％; Value: 10K; 存货编码: 1110102007
R76 R77 = 1110102043: 序号: 56; 存货名称: 贴装电阻; 规格型号: 0402,330Ω,±5％; Value: 330R; 存货编码: 1110102043
U7 = 1110405363: 序号: 4251; 存货名称: 常规IC; 规格型号: RTL8211FSI-CG,QFN48; 描述: 替代1110405358; 禁用状态: 否; Value: RTL8211FSI-CG; 存货编码: 1110405363
U8 U9 = 1110503037: 存货名称: TVS管; 规格型号: TPD4E05U06DQAR,USON; Value: TPD4E05U06DQAR; 存货编码: 1110503037
X1 = 1110601037: 序号: 3392; 存货名称: 贴装晶振; 规格型号: 无源,25MHZ,4P,3.2*2.5mm,±20ppm,20pf; Value: 25MHZ; 存货编码: 1110601037